# Altium project a0206-2006.PrjPcb (part 4 of 5)

## Sheet a0206-2006.13.SchDoc
size 558 x 431 mm
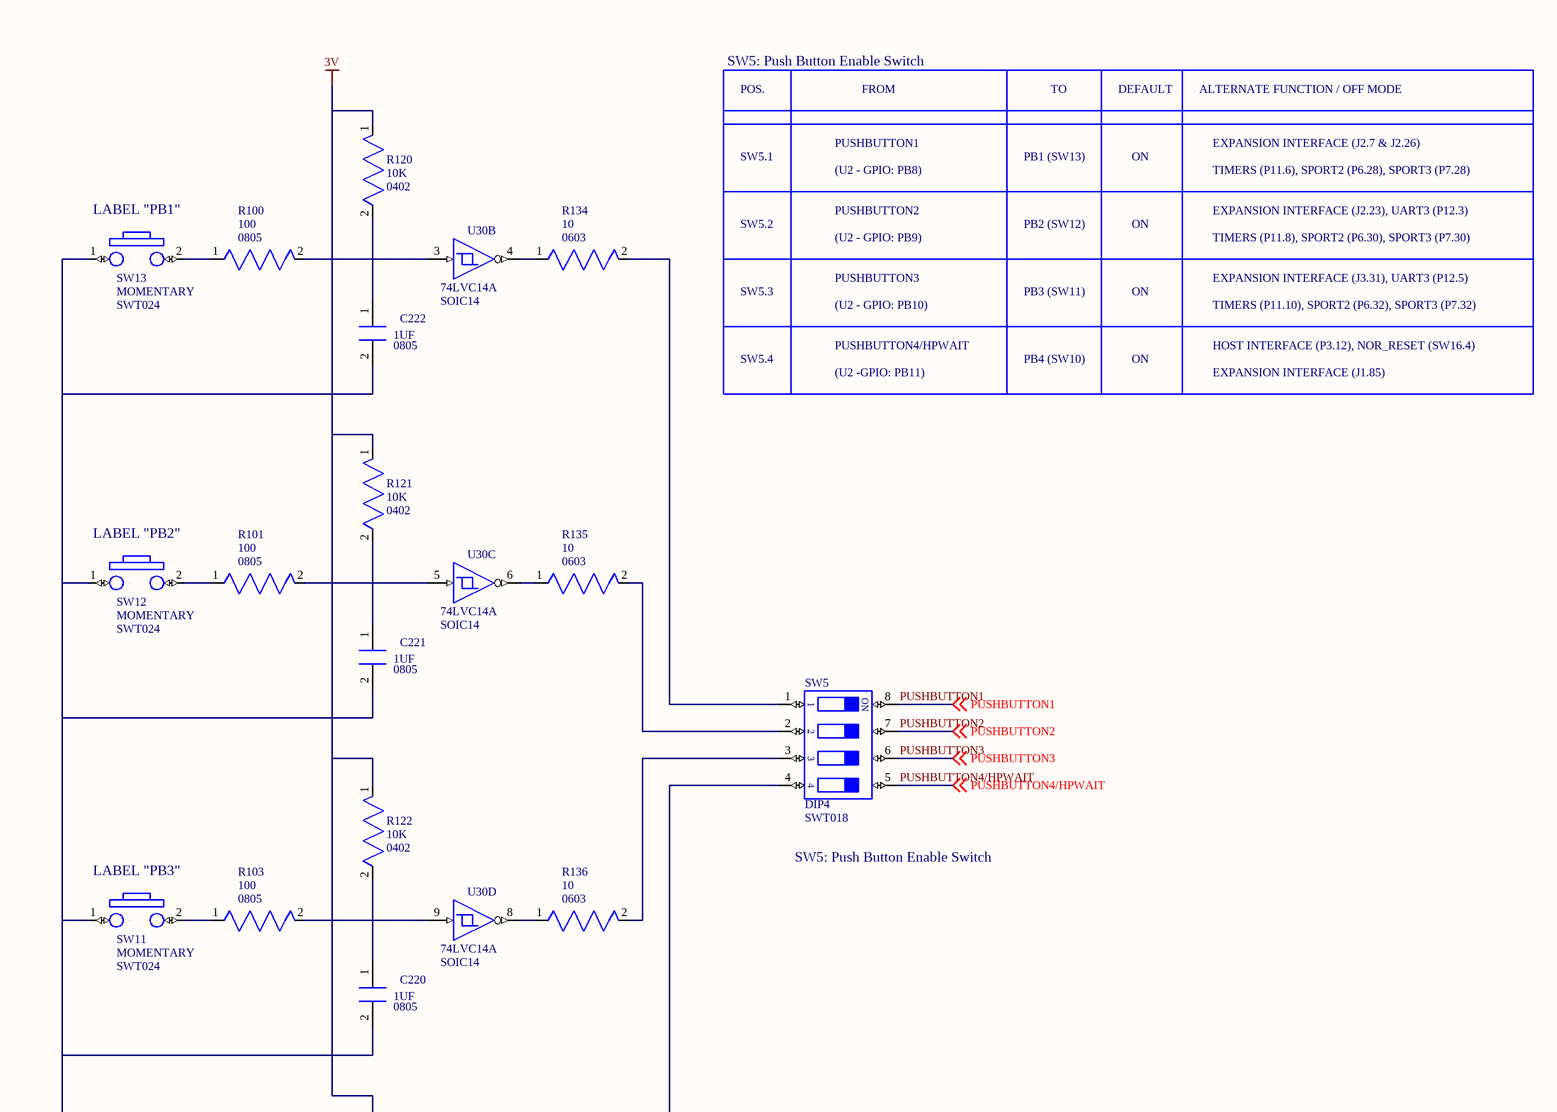
[diagram p41: a0206-2006.13.SchDoc, top left]
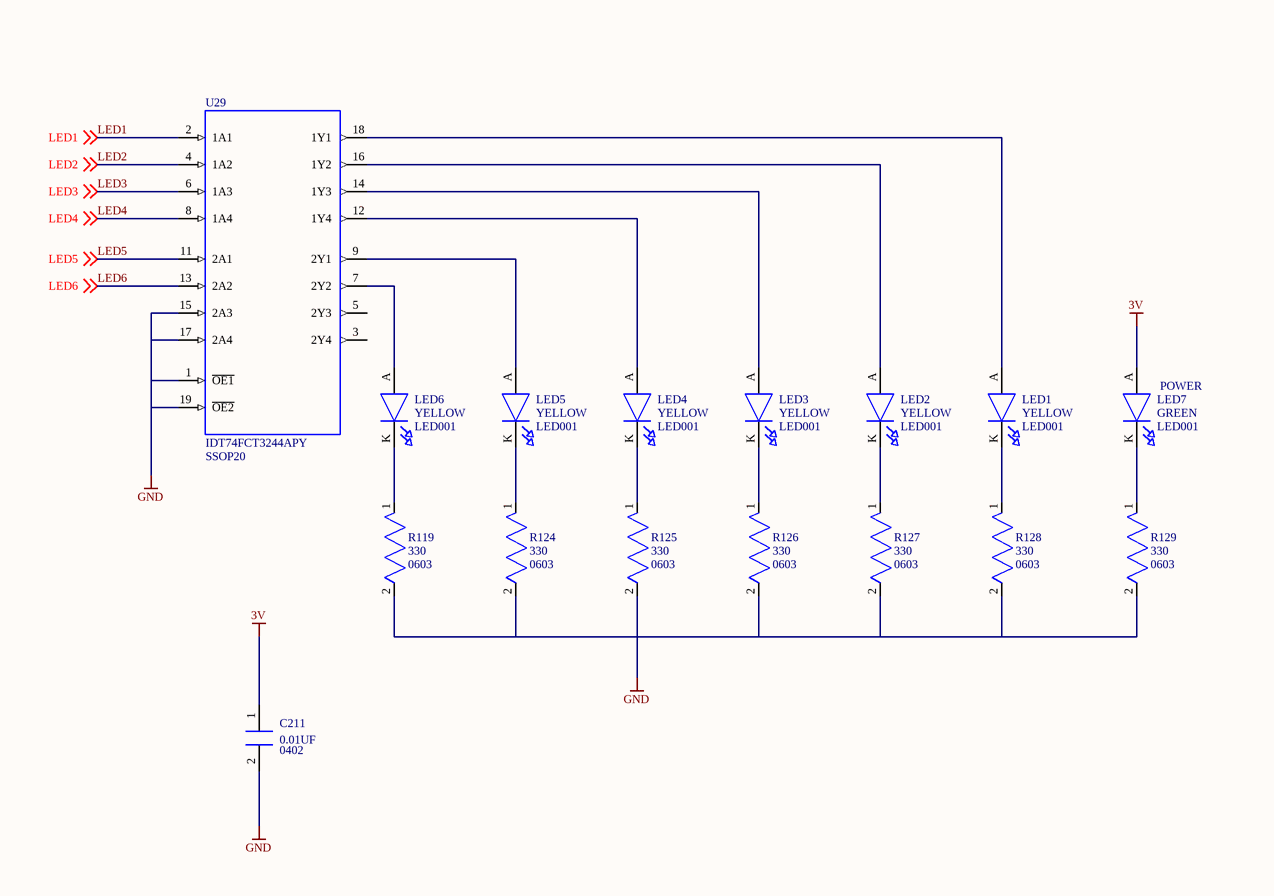
[diagram p42: a0206-2006.13.SchDoc, top right]
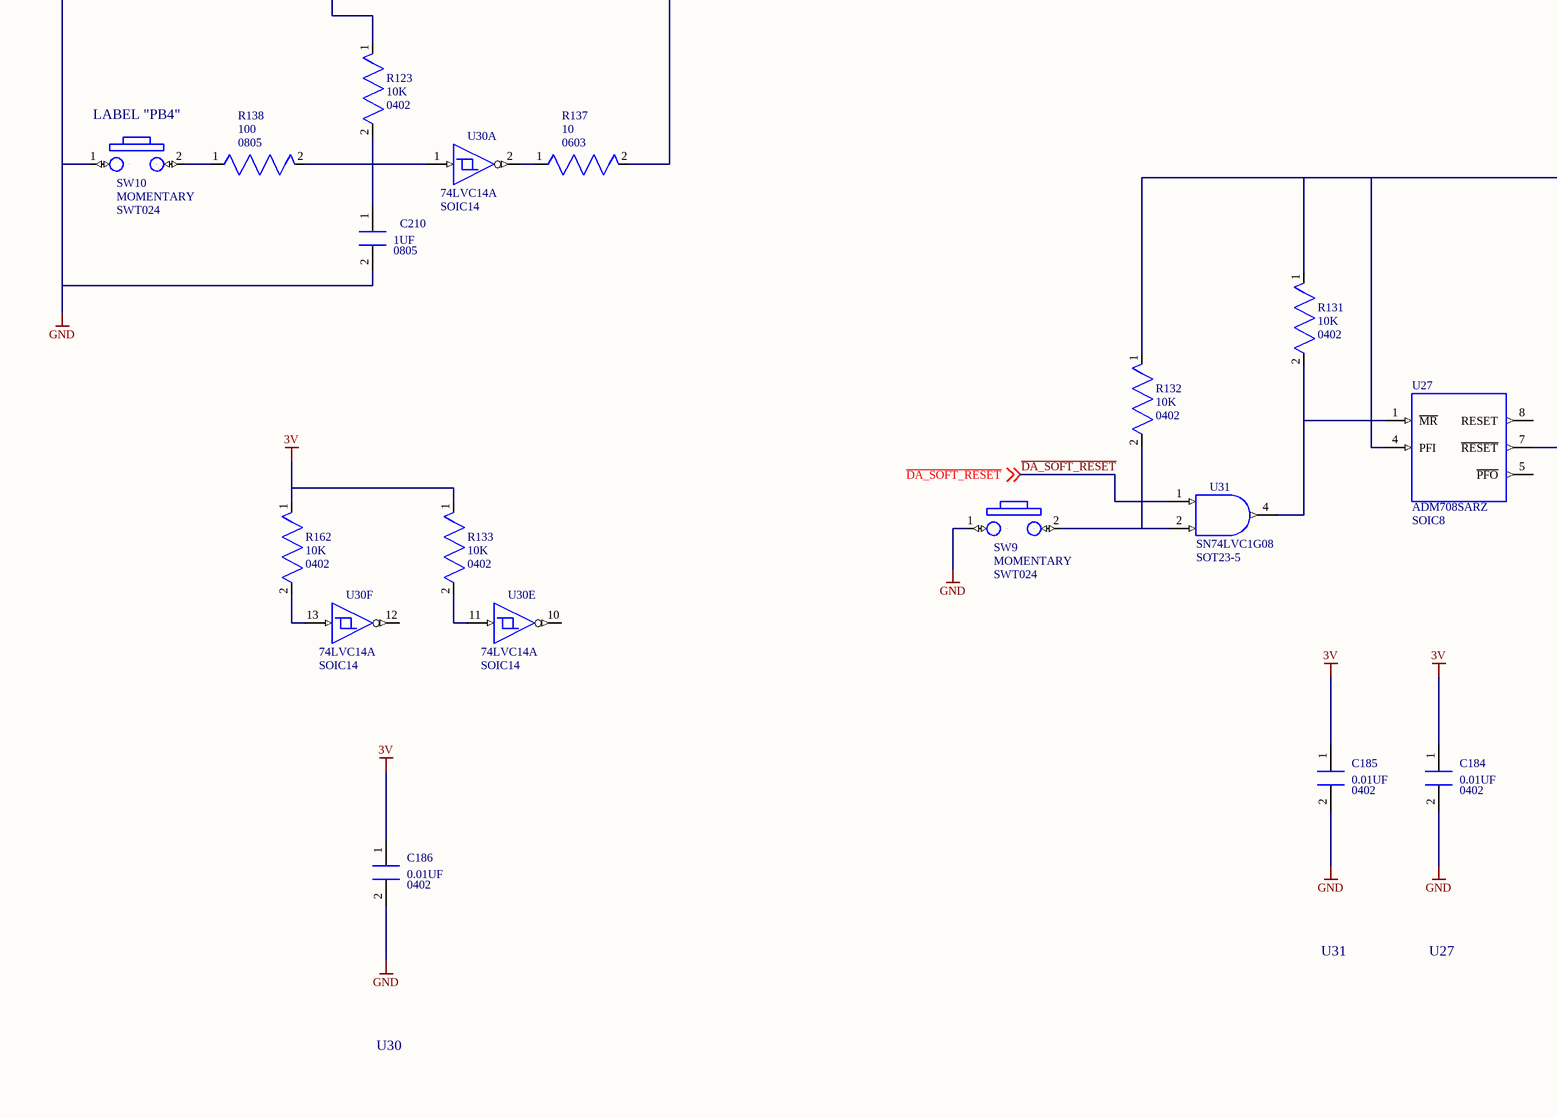
[diagram p43: a0206-2006.13.SchDoc, bottom left]
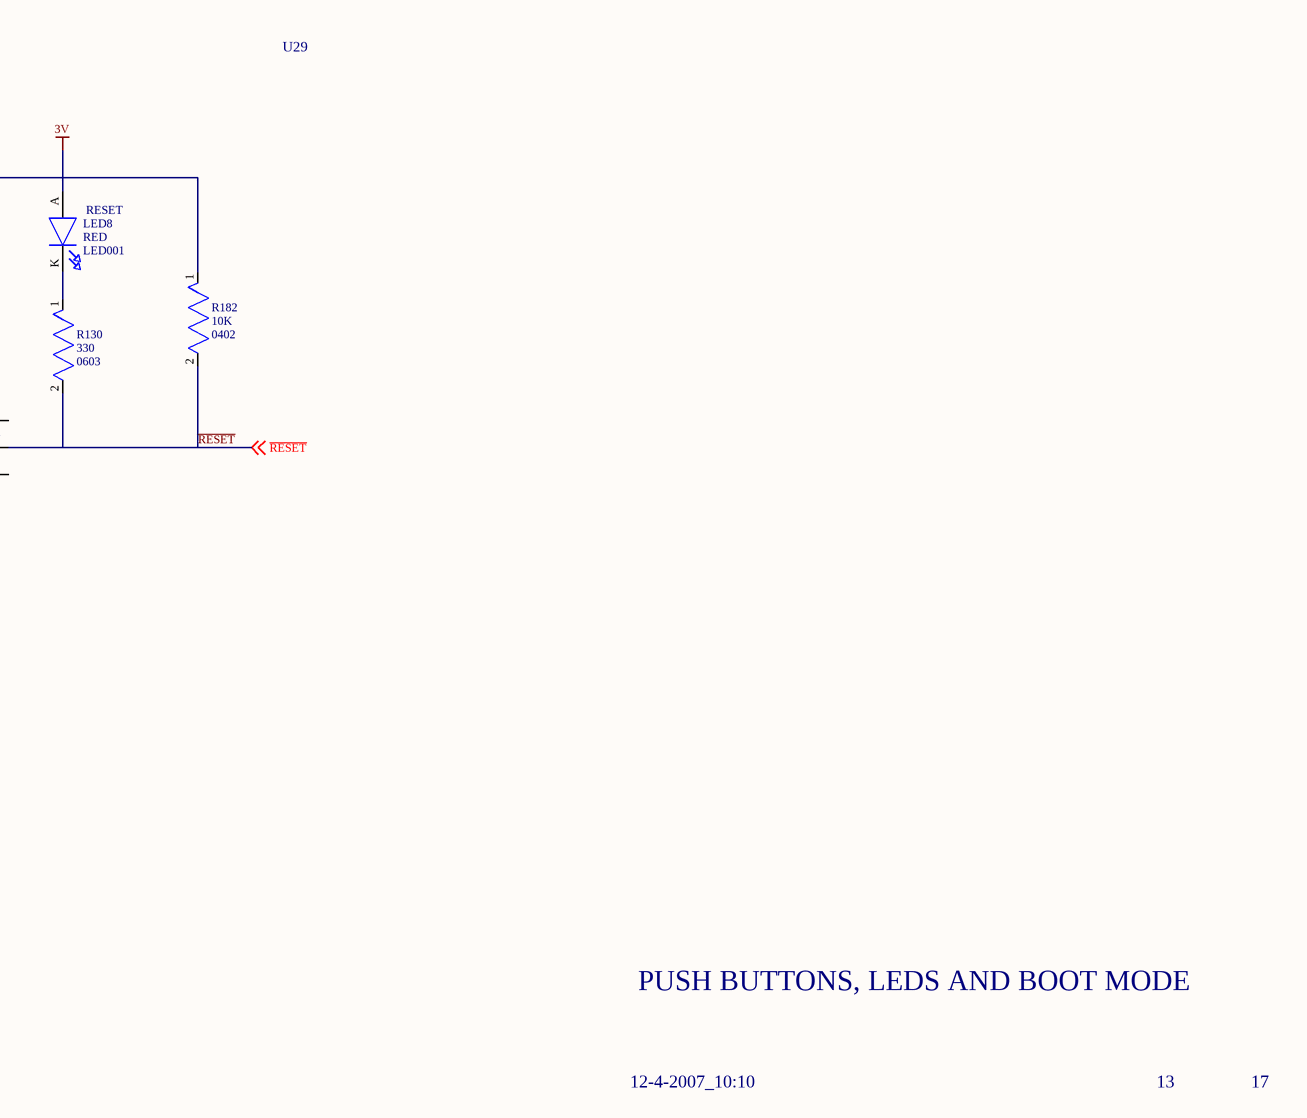
[diagram p44: a0206-2006.13.SchDoc, bottom right]

### Parts
C184  value 0.01UF  [0402]  (hidden comment: *)
C185  value 0.01UF  [0402]  (hidden comment: *)
C186  value 0.01UF  [0402]  (hidden comment: *)
C210  value 1UF  [0805]  (hidden comment: *)
C211  value 0.01UF  [0402]  (hidden comment: *)
C220  value 1UF  [0805]  (hidden comment: *)
C221  value 1UF  [0805]  (hidden comment: *)
C222  value 1UF  [0805]  (hidden comment: *)
LED1  value YELLOW  [LED001]  (hidden comment: *)
LED2  value YELLOW  [LED001]  (hidden comment: *)
LED3  value YELLOW  [LED001]  (hidden comment: *)
LED4  value YELLOW  [LED001]  (hidden comment: *)
LED5  value YELLOW  [LED001]  (hidden comment: *)
LED6  value YELLOW  [LED001]  (hidden comment: *)
LED7  value GREEN  [LED001]  (hidden comment: *)
LED8  value RED  [LED001]  (hidden comment: *)
R100  value 100  [0805]  (hidden comment: *)
R101  value 100  [0805]  (hidden comment: *)
R103  value 100  [0805]  (hidden comment: *)
R119  value 330  [0603]  (hidden comment: *)
R120  value 10K  [0402]  (hidden comment: *)
R121  value 10K  [0402]  (hidden comment: *)
R122  value 10K  [0402]  (hidden comment: *)
R123  value 10K  [0402]  (hidden comment: *)
R124  value 330  [0603]  (hidden comment: *)
R125  value 330  [0603]  (hidden comment: *)
R126  value 330  [0603]  (hidden comment: *)
R127  value 330  [0603]  (hidden comment: *)
R128  value 330  [0603]  (hidden comment: *)
R129  value 330  [0603]  (hidden comment: *)
R130  value 330  [0603]  (hidden comment: *)
R131  value 10K  [0402]  (hidden comment: *)
R132  value 10K  [0402]  (hidden comment: *)
R133  value 10K  [0402]  (hidden comment: *)
R134  value 10  [0603]  (hidden comment: *)
R135  value 10  [0603]  (hidden comment: *)
R136  value 10  [0603]  (hidden comment: *)
R137  value 10  [0603]  (hidden comment: *)
R138  value 100  [0805]  (hidden comment: *)
R162  value 10K  [0402]  (hidden comment: *)
R182  value 10K  [0402]  (hidden comment: *)
SW5  value DIP4  [SWT018]  (hidden comment: *)
SW9  value MOMENTARY  [SWT024]  (hidden comment: *)
SW10  value MOMENTARY  [SWT024]  (hidden comment: *)
SW11  value MOMENTARY  [SWT024]  (hidden comment: *)
SW12  value MOMENTARY  [SWT024]  (hidden comment: *)
SW13  value MOMENTARY  [SWT024]  (hidden comment: *)
U27  PART: ADM708SARZ  [SOIC8]  (hidden comment: *)
U29  PART: IDT74FCT3244APY  [SSOP20]  (hidden comment: *)
U30  PART: 74LVC14A  [SOIC14]  (hidden comment: *)  (parts A,B,C,D,E,F of 6)
U31  PART: SN74LVC1G08  [SOT23-5]  (hidden comment: *)

### Nets
3V: C184.1(A) C185.1(A) C186.1(A) C211.1(A) LED7.A(ANODE) LED8.A(ANODE) R120.1(N1) R121.1(N1) R122.1(N1) R123.1(N1) R131.1(N1) R132.1(N1) R133.1(N1) R162.1(N1) R182.1(N1) U27.4(PFI) U27.2(3V) U29.20(3V) U30.14(3V) U31.5(3V)
GND: C184.2(B) C185.2(B) C186.2(B) C210.2(B) C211.2(B) C220.2(B) C221.2(B) C222.2(B) R119.2(N2) R124.2(N2) R125.2(N2) R126.2(N2) R127.2(N2) R128.2(N2) R129.2(N2) SW9.1 SW10.1 SW11.1 SW12.1 SW13.1 U27.3(GND) U29.1(~{OE1}) U29.10(GND) U29.15(2A3) U29.17(2A4) U29.19(~{OE2}) U30.7(GND) U31.3(GND)
~{DA_SOFT_RESET}: U31.1(A) ; off-sheet ~{DA_SOFT_RESET}
LED1: U29.2(1A1) ; off-sheet LED1
LED2: U29.4(1A2) ; off-sheet LED2
LED3: U29.6(1A3) ; off-sheet LED3
LED4: U29.8(1A4) ; off-sheet LED4
LED5: U29.11(2A1) ; off-sheet LED5
LED6: U29.13(2A2) ; off-sheet LED6
PUSHBUTTON1: SW5.8 ; off-sheet PUSHBUTTON1
PUSHBUTTON2: SW5.7 ; off-sheet PUSHBUTTON2
PUSHBUTTON3: SW5.6 ; off-sheet PUSHBUTTON3
PUSHBUTTON4/HPWAIT: SW5.5 ; off-sheet PUSHBUTTON4/HPWAIT
~{RESET}: R130.2(N2) R182.2(N2) U27.7(~{RESET}) ; off-sheet ~{RESET}
NetC210_1: C210.1(A) R123.2(N2) R138.2(N2) U30.1(A)
NetC220_1: C220.1(A) R103.2(N2) R122.2(N2) U30.9(A)
NetC221_1: C221.1(A) R101.2(N2) R121.2(N2) U30.5(A)
NetC222_1: C222.1(A) R100.2(N2) R120.2(N2) U30.3(A)
NetLED1_A: LED1.A(ANODE) U29.18(1Y1)
NetLED1_K: LED1.K(CATHODE) R128.1(N1)
NetLED2_A: LED2.A(ANODE) U29.16(1Y2)
NetLED2_K: LED2.K(CATHODE) R127.1(N1)
NetLED3_A: LED3.A(ANODE) U29.14(1Y3)
NetLED3_K: LED3.K(CATHODE) R126.1(N1)
NetLED4_A: LED4.A(ANODE) U29.12(1Y4)
NetLED4_K: LED4.K(CATHODE) R125.1(N1)
NetLED5_A: LED5.A(ANODE) U29.9(2Y1)
NetLED5_K: LED5.K(CATHODE) R124.1(N1)
NetLED6_A: LED6.A(ANODE) U29.7(2Y2)
NetLED6_K: LED6.K(CATHODE) R119.1(N1)
NetLED7_K: LED7.K(CATHODE) R129.1(N1)
NetLED8_K: LED8.K(CATHODE) R130.1(N1)
NetR100_1: R100.1(N1) SW13.2
NetR101_1: R101.1(N1) SW12.2
NetR103_1: R103.1(N1) SW11.2
NetR131_2: R131.2(N2) U27.1(~{MR}) U31.4(Y)
NetR132_2: R132.2(N2) SW9.2 U31.2(B)
NetR133_2: R133.2(N2) U30.11(A)
NetR134_1: R134.1(N1) U30.4(Y)
NetR134_2: R134.2(N2) SW5.1
NetR135_1: R135.1(N1) U30.6(Y)
NetR135_2: R135.2(N2) SW5.2
NetR136_1: R136.1(N1) U30.8(Y)
NetR136_2: R136.2(N2) SW5.3
NetR137_1: R137.1(N1) U30.2(Y)
NetR137_2: R137.2(N2) SW5.4
NetR138_1: R138.1(N1) SW10.2
NetR162_2: R162.2(N2) U30.13(A)

Not connected (* = marked no-connect by the designer): U27 5(~{PFO}) 6 8(RESET); U29 3(2Y4) 5(2Y3); U30 10(Y) 12(Y)

### Notes on the sheet
- SW5: Push Button Enable Switch
- POS.
- FROM
- TO
- DEFAULT
- ALTERNATE FUNCTION / OFF MODE
- SW5.1
- PUSHBUTTON1
- PB1 (SW13)
- ON
- EXPANSION INTERFACE (J2.7 & J2.26)
- LABEL "PB1"
- SW5.2
- PUSHBUTTON2
- (U2 - GPIO: PB8)
- PB2 (SW12)
- TIMERS (P11.6), SPORT2 (P6.28), SPORT3 (P7.28)
- EXPANSION INTERFACE (J2.23), UART3 (P12.3)
- SW5.3
- PUSHBUTTON3
- (U2 - GPIO: PB9)
- PB3 (SW11)
- TIMERS (P11.8), SPORT2 (P6.30), SPORT3 (P7.30)
- EXPANSION INTERFACE (J3.31), UART3 (P12.5)
- SW5.4
- PUSHBUTTON4/HPWAIT
- (U2 - GPIO: PB10)
- PB4 (SW10)
- HOST INTERFACE (P3.12), NOR_RESET (SW16.4)
- TIMERS (P11.10), SPORT2 (P6.32), SPORT3 (P7.32)
- (U2 -GPIO: PB11)
- EXPANSION INTERFACE (J1.85)
- LABEL "PB2"
- (near LED7) POWER
- LABEL "PB3"
- U29
- LABEL "PB4"
- (near LED8) RESET
- U31
- U27
- PUSH BUTTONS, LEDS AND BOOT MODE
- U30
- 12-4-2007_10:10
- 13
- 17
- A
- B
- C
- D
- 1
- 2
- 3
- 20 Cotton Road
- 4
- DEVICES
- ANALOG
- Nashua, NH 03063
- PH: 1-800-ANALOGD
- Title
- ADSP-BF548 EZ-KIT LITE
- Size
- Board No.
- A0206-2006
- Rev
- 1.4B
- Date
- Sheet
- of
- (in symbol SW_DIP4.1) ON

### Library data of the parts
C184 C186 = CAP_NON_POLARIZED.2: PART_SPEC: CAPACITOR; LEVEL: STD; TYPE: X7R; BOARDS: BOTH; PRT_NUM: 7000279; VOLTAGE: 16V; TOLERANCE: 10%; PKG_TYPE: 0402; ROHS: ROHS
C185 = CAP_NON_POLARIZED.2: PART_SPEC: CAPACITOR; LEVEL: STD; TYPE: X7R; BOARDS: BOTH; TOLERANCE: 10%; VOLTAGE: 16V; PRT_NUM: 7000279; PKG_TYPE: 0402; ROHS: ROHS
C210 = CAP_NON_POLARIZED.2: PART_SPEC: CAPACITOR; LEVEL: STD; TYPE: X7R; BOARDS: BOTH; PRT_NUM: 7000264; VOLTAGE: 10V; TOLERANCE: 10%; PKG_TYPE: 0805; ROHS: ROHS
C211 = CAP_NON_POLARIZED.2: PART_SPEC: CAPACITOR; LEVEL: STD; TYPE: X7R; PRT_NUM: 7000279; VOLTAGE: 16V; TOLERANCE: 10%; BOARDS: BOTH; PKG_TYPE: 0402; ROHS: ROHS
C220 C222 = CAP_NON_POLARIZED.2: PART_SPEC: CAPACITOR; LEVEL: STD; TYPE: X7R; TOLERANCE: 10%; VOLTAGE: 10V; PRT_NUM: 7000264; BOARDS: BOTH; PKG_TYPE: 0805; ROHS: ROHS
C221 = CAP_NON_POLARIZED.2: PART_SPEC: CAPACITOR; LEVEL: STD; TYPE: X7R; PRT_NUM: 7000264; VOLTAGE: 10V; TOLERANCE: 10%; BOARDS: BOTH; PKG_TYPE: 0805; ROHS: ROHS
LED1-LED6 = LED_STANDARD.3: PART_SPEC: LED; LEVEL: STD; BOARDS: BOTH; PRT_NUM: 7000027; PKG_TYPE: LED001; ROHS: ROHS
LED7 = LED_STANDARD.3: PART_SPEC: LED; LEVEL: STD; BOARDS: BOTH; PRT_NUM: 7000499; PKG_TYPE: LED001; ROHS: ROHS
LED8 = LED_STANDARD.3: PART_SPEC: LED; LEVEL: STD; BOARDS: BOTH; PRT_NUM: 7000500; PKG_TYPE: LED001; ROHS: ROHS
R100 R103 = RES_STANDARD.1: PART_SPEC: RESISTOR; LEVEL: STD; POWER: 1/10W; BOARDS: BOTH; PRT_NUM: 7000097; TOLERANCE: 5%; PKG_TYPE: 0805; ROHS: ROHS
R101 = RES_STANDARD.1: PART_SPEC: RESISTOR; LEVEL: STD; POWER: 1/10W; BOARDS: BOTH; TOLERANCE: 5%; PRT_NUM: 7000097; PKG_TYPE: 0805; ROHS: ROHS
R119 R125 R127 R129 R130 = RES_STANDARD.2: PART_SPEC: RESISTOR; LEVEL: STD; POWER: 1/10W; BOARDS: BOTH; PRT_NUM: 7000368; TOLERANCE: 5%; PKG_TYPE: 0603; ROHS: ROHS
R120-R123 R162 = RES_STANDARD.2: PART_SPEC: RESISTOR; LEVEL: STD; POWER: 1/16W; BOARDS: BOTH; TOLERANCE: 5%; PRT_NUM: 7000280; PKG_TYPE: 0402; ROHS: ROHS
R124 R126 R128 = RES_STANDARD.2: PART_SPEC: RESISTOR; LEVEL: STD; POWER: 1/10W; BOARDS: BOTH; TOLERANCE: 5%; PRT_NUM: 7000368; PKG_TYPE: 0603; ROHS: ROHS
R131 R132 R182 = RES_STANDARD.2: PART_SPEC: RESISTOR; LEVEL: STD; POWER: 1/16W; BOARDS: BOTH; PRT_NUM: 7000280; TOLERANCE: 5%; PKG_TYPE: 0402; ROHS: ROHS
R133 = RES_STANDARD.2: PART_SPEC: RESISTOR; LEVEL: STD; POWER: 1/16W; PRT_NUM: 7000280; TOLERANCE: 5%; BOARDS: BOTH; PKG_TYPE: 0402; ROHS: ROHS
R134 R136 = RES_STANDARD.1: PART_SPEC: RESISTOR; LEVEL: STD; POWER: 1/10W; BOARDS: BOTH; TOLERANCE: 5%; PRT_NUM: 7000374; PKG_TYPE: 0603; ROHS: ROHS
R135 R137 = RES_STANDARD.1: PART_SPEC: RESISTOR; LEVEL: STD; POWER: 1/10W; BOARDS: BOTH; PRT_NUM: 7000374; TOLERANCE: 5%; PKG_TYPE: 0603; ROHS: ROHS
R138 = RES_STANDARD.1: PART_SPEC: RESISTOR; LEVEL: STD; TOLERANCE: 5%; PRT_NUM: 7000097; BOARDS: BOTH; POWER: 1/10W; PKG_TYPE: 0805; ROHS: ROHS
SW5 = SW_DIP4.1: 4PIN-SMT-SWT; PART_SPEC: SWITCH; LEVEL: STD; PRT_NUM: 6000144; BOARDS: KIT; PKG_TYPE: SWT018; ROHS: ROHS
SW9-SW13 = SW_MOM_PB.1: 6MM; PART_SPEC: SWITCH; LEVEL: STD; BOARDS: BOTH; PRT_NUM: 6000832; PKG_TYPE: SWT024; ROHS: ROHS
U27 = ICS_ADM708AR.1: VOLTAGE-SUPERVISOR; NC: 6; LEVEL: STD; BOARDS: BOTH; PRT_NUM: 30-024902-01; PKG_TYPE: SOIC8; ROHS: ROHS; WEB: http://www.analog.com/en/prod/0%2C2877%2CADM708%2C00.html
U29 = ICS_SN74XXX244.1: 3.3V-OCTAL-BUFFER; LEVEL: STD; BOARDS: BOTH; PRT_NUM: 1000106; PKG_TYPE: SSOP20; ROHS: ROHS; WEB: http://www.idt.com/?genID
U30 = ICS_SN74XXX14.1: HEX-INVER-SCHMITT-TRIGGER; LEVEL: STD; BOARDS: BOTH; PRT_NUM: 1000097; PKG_TYPE: SOIC14; WEB: http://focus.ti.com/docs/prod/folders/print/sn74lvc14a.html; ROHS: ROHS
U31 = ICS_SN74XXX1G08.1: SINGLE 2-INPUT AND; LEVEL: STD; BOARDS: BOTH; PRT_NUM: 1000287; PKG_TYPE: SOT23-5; ROHS: ROHS; WEB: http://focus.ti.com/docs/prod/folders/print/sn74lvc1g08.html

## Sheet a0206-2006.14.SchDoc
size 558 x 431 mm
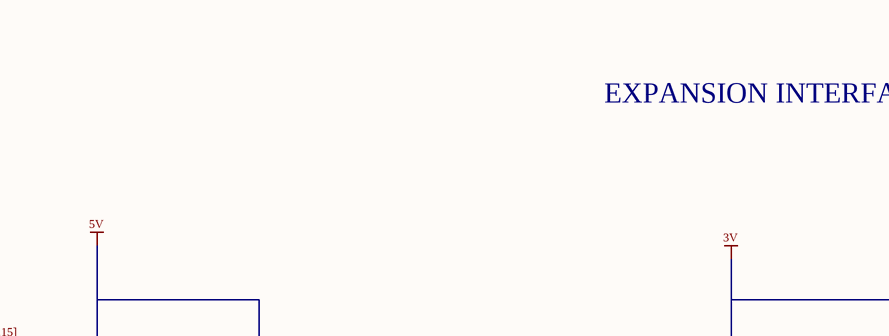
[diagram p45: a0206-2006.14.SchDoc, top left]
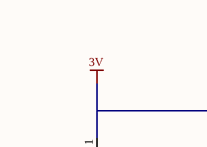
[diagram p46: a0206-2006.14.SchDoc, top right]
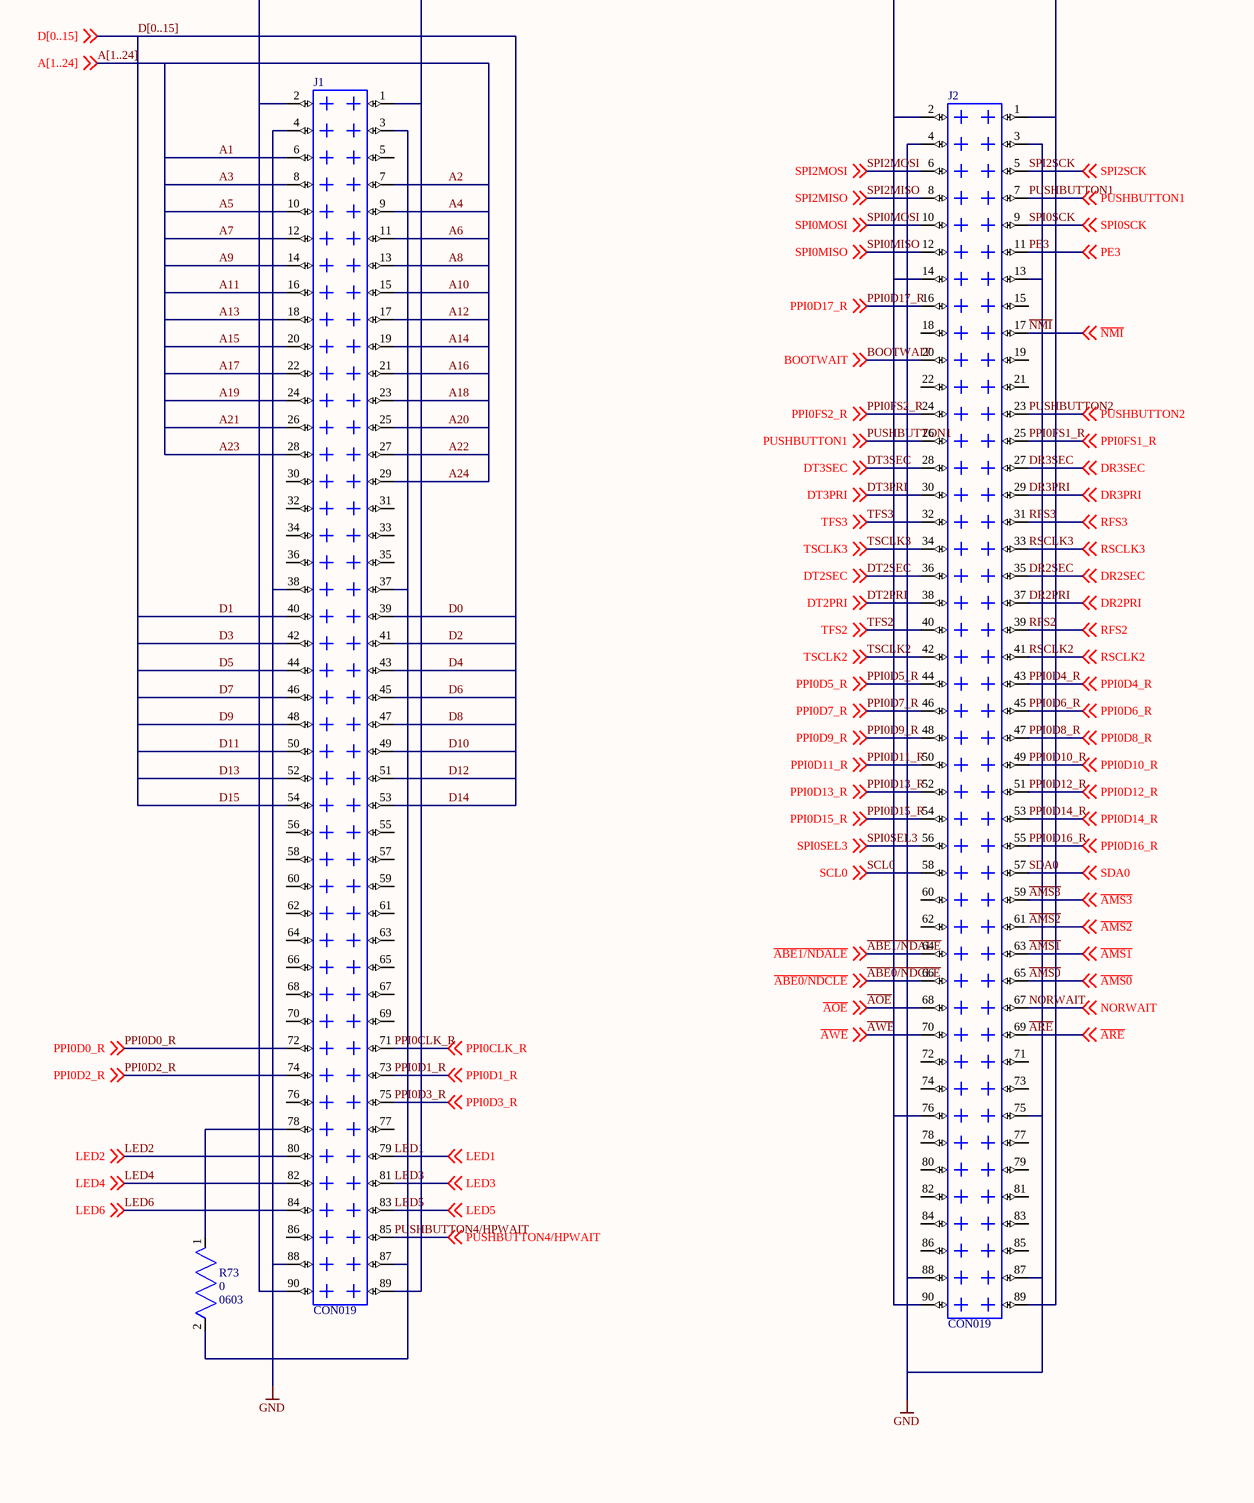
[diagram p47: a0206-2006.14.SchDoc, bottom left]
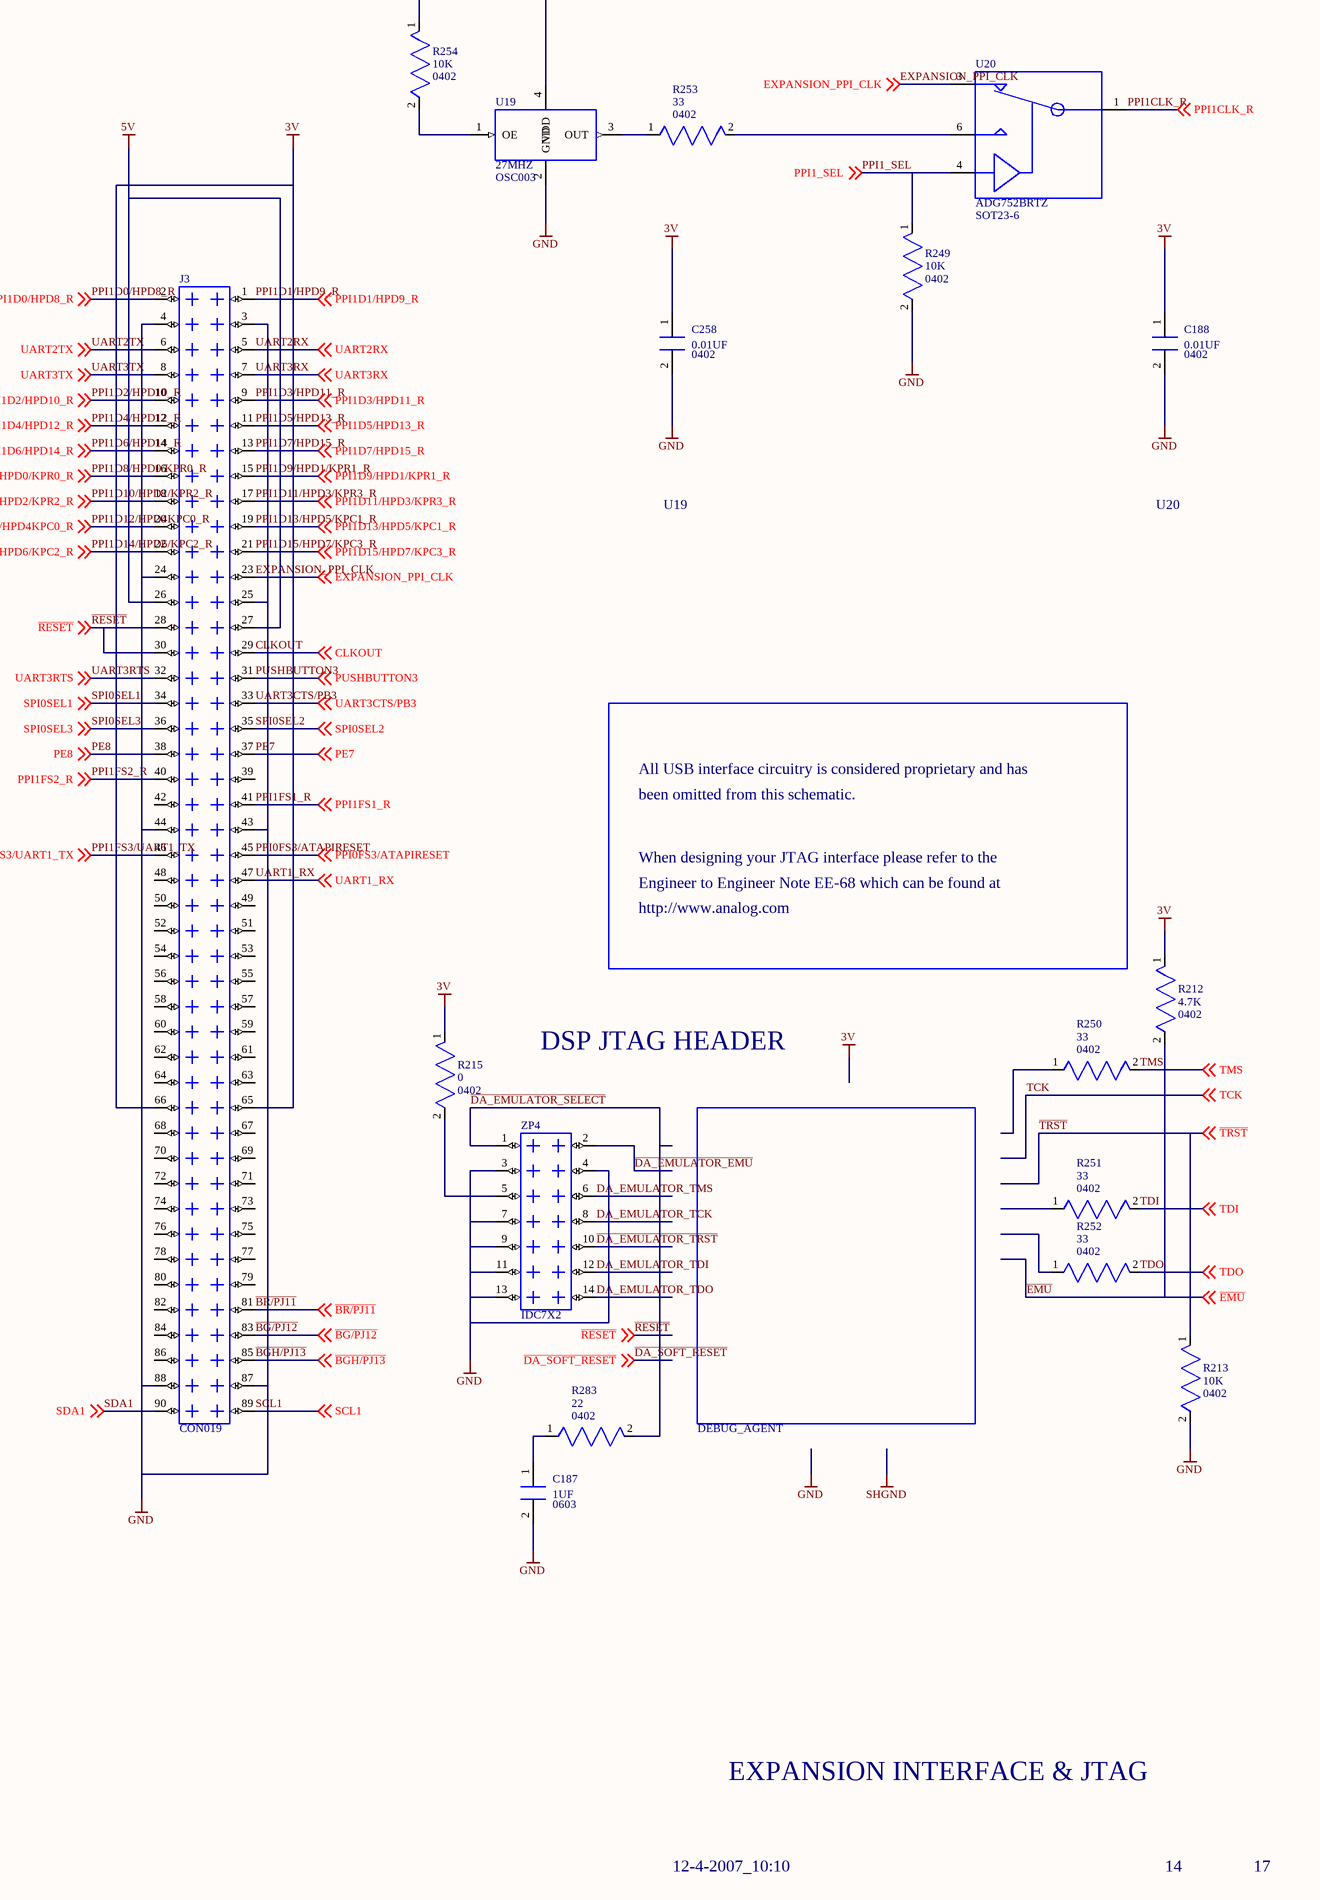
[diagram p48: a0206-2006.14.SchDoc, bottom right]

### Parts
(Parts that share a designator on the sheet are numbered #1, #2 ... from top to bottom, then left to right.)
*#2  DEBUG_AGENT  [DEBUG_AGENT]
C187  value 1UF  [0603]  (hidden comment: *)
C188  value 0.01UF  [0402]  (hidden comment: *)
C258  value 0.01UF  [0402]  (hidden comment: *)
J1  *  [CON019]  (value not drawn)
J2  *  [CON019]  (value not drawn)
J3  *  [CON019]  (value not drawn)
R73  value 0  [0603]  (hidden comment: *)
R212  value 4.7K  [0402]  (hidden comment: *)
R213  value 10K  [0402]  (hidden comment: *)
R215  value 0  [0402]  (hidden comment: *)
R249  value 10K  [0402]  (hidden comment: *)
R250  value 33  [0402]  (hidden comment: *)
R251  value 33  [0402]  (hidden comment: *)
R252  value 33  [0402]  (hidden comment: *)
R253  value 33  [0402]  (hidden comment: *)
R254  value 10K  [0402]  (hidden comment: *)
R283  value 22  [0402]  (hidden comment: *)
U19  value 27MHZ  [OSC003]  (hidden comment: *)
U20  PART: ADG752BRTZ  [SOT23-6]  (hidden comment: *)
ZP4  *  [IDC7X2]  (value not drawn)

### Nets
3V: C188.1(A) C258.1(A) J2.1 J2.2 J2.14 J2.76 J2.89 J2.90 J3.65 J3.66 R212.1(N1) R215.1(N1) R254.1(N1) U19.4(VDD) U20.2(3V)
5V: J1.1 J1.2 J1.89 J1.90 J3.26 J3.27
GND: C187.2(B) C188.2(B) C258.2(B) J1.3 J1.4 J1.37 J1.38 J1.87 J1.88 J2.3 J2.4 J2.13 J2.75 J2.87 J2.88 J3.3 J3.4 J3.24 J3.25 J3.43 J3.44 J3.87 J3.88 R73.2(N2) R213.2(N2) R249.2(N2) U19.2(GND) U20.5(GND) ZP4.3 ZP4.4 ZP4.7 ZP4.9 ZP4.11 ZP4.13
A1: J1.6
A2: J1.7
A3: J1.8
A4: J1.9
A5: J1.10
A6: J1.11
A7: J1.12
A8: J1.13
A9: J1.14
A10: J1.15
A11: J1.16
A12: J1.17
A13: J1.18
A14: J1.19
A15: J1.20
A16: J1.21
A17: J1.22
A18: J1.23
A19: J1.24
A20: J1.25
A21: J1.26
A22: J1.27
A23: J1.28
A24: J1.29
~{ABE0/NDCLE}: J2.66 ; off-sheet ~{ABE0/NDCLE}
~{ABE1/NDALE}: J2.64 ; off-sheet ~{ABE1/NDALE}
~{AMS0}: J2.65 ; off-sheet ~{AMS0}
~{AMS1}: J2.63 ; off-sheet ~{AMS1}
~{AMS2}: J2.61 ; off-sheet ~{AMS2}
~{AMS3}: J2.59 ; off-sheet ~{AMS3}
~{AOE}: J2.68 ; off-sheet ~{AOE}
~{ARE}: J2.69 ; off-sheet ~{ARE}
~{AWE}: J2.70 ; off-sheet ~{AWE}
~{BG/PJ12}: J3.83 ; off-sheet ~{BG/PJ12}
~{BGH/PJ13}: J3.85 ; off-sheet ~{BGH/PJ13}
~{BR/PJ11}: J3.81 ; off-sheet ~{BR/PJ11}
BOOTWAIT: J2.20 ; off-sheet BOOTWAIT
CLKOUT: J3.29 ; off-sheet CLKOUT
D0: J1.39
D1: J1.40
D2: J1.41
D3: J1.42
D4: J1.43
D5: J1.44
D6: J1.45
D7: J1.46
D8: J1.47
D9: J1.48
D10: J1.49
D11: J1.50
D12: J1.51
D13: J1.52
D14: J1.53
D15: J1.54
~{DA_EMULATOR_EMU}: ZP4.2
~{DA_EMULATOR_SELECT}: R283.2(N2) ZP4.1
~{DA_EMULATOR_TRST}: ZP4.10
DA_EMULATOR_TCK: ZP4.8
DA_EMULATOR_TDI: ZP4.12
DA_EMULATOR_TDO: ZP4.14
DA_EMULATOR_TMS: ZP4.6
DR2PRI: J2.37 ; off-sheet DR2PRI
DR2SEC: J2.35 ; off-sheet DR2SEC
DR3PRI: J2.29 ; off-sheet DR3PRI
DR3SEC: J2.27 ; off-sheet DR3SEC
DT2PRI: J2.38 ; off-sheet DT2PRI
DT2SEC: J2.36 ; off-sheet DT2SEC
DT3PRI: J2.30 ; off-sheet DT3PRI
DT3SEC: J2.28 ; off-sheet DT3SEC
~{EMU}: R212.2(N2) ; off-sheet ~{EMU}
EXPANSION_PPI_CLK: J3.23 U20.3(S1) ; off-sheet EXPANSION_PPI_CLK
LED1: J1.79 ; off-sheet LED1
LED2: J1.80 ; off-sheet LED2
LED3: J1.81 ; off-sheet LED3
LED4: J1.82 ; off-sheet LED4
LED5: J1.83 ; off-sheet LED5
LED6: J1.84 ; off-sheet LED6
~{NMI}: J2.17 ; off-sheet ~{NMI}
NORWAIT: J2.67 ; off-sheet NORWAIT
PE3: J2.11 ; off-sheet PE3
PE7: J3.37 ; off-sheet PE7
PE8: J3.38 ; off-sheet PE8
PPI0CLK_R: J1.71 ; off-sheet PPI0CLK_R
PPI0D0_R: J1.72 ; off-sheet PPI0D0_R
PPI0D1_R: J1.73 ; off-sheet PPI0D1_R
PPI0D2_R: J1.74 ; off-sheet PPI0D2_R
PPI0D3_R: J1.75 ; off-sheet PPI0D3_R
PPI0D4_R: J2.43 ; off-sheet PPI0D4_R
PPI0D5_R: J2.44 ; off-sheet PPI0D5_R
PPI0D6_R: J2.45 ; off-sheet PPI0D6_R
PPI0D7_R: J2.46 ; off-sheet PPI0D7_R
PPI0D8_R: J2.47 ; off-sheet PPI0D8_R
PPI0D9_R: J2.48 ; off-sheet PPI0D9_R
PPI0D10_R: J2.49 ; off-sheet PPI0D10_R
PPI0D11_R: J2.50 ; off-sheet PPI0D11_R
PPI0D12_R: J2.51 ; off-sheet PPI0D12_R
PPI0D13_R: J2.52 ; off-sheet PPI0D13_R
PPI0D14_R: J2.53 ; off-sheet PPI0D14_R
PPI0D15_R: J2.54 ; off-sheet PPI0D15_R
PPI0D16_R: J2.55 ; off-sheet PPI0D16_R
PPI0D17_R: J2.16 ; off-sheet PPI0D17_R
PPI0FS1_R: J2.25 ; off-sheet PPI0FS1_R
PPI0FS2_R: J2.24 ; off-sheet PPI0FS2_R
PPI0FS3/ATAPIRESET: J3.45 ; off-sheet PPI0FS3/ATAPIRESET
PPI1_SEL: R249.1(N1) U20.4(IN) ; off-sheet PPI1_SEL
PPI1CLK_R: U20.1(D) ; off-sheet PPI1CLK_R
PPI1D0/HPD8_R: J3.2 ; off-sheet PPI1D0/HPD8_R
PPI1D1/HPD9_R: J3.1 ; off-sheet PPI1D1/HPD9_R
PPI1D2/HPD10_R: J3.10 ; off-sheet PPI1D2/HPD10_R
PPI1D3/HPD11_R: J3.9 ; off-sheet PPI1D3/HPD11_R
PPI1D4/HPD12_R: J3.12 ; off-sheet PPI1D4/HPD12_R
PPI1D5/HPD13_R: J3.11 ; off-sheet PPI1D5/HPD13_R
PPI1D6/HPD14_R: J3.14 ; off-sheet PPI1D6/HPD14_R
PPI1D7/HPD15_R: J3.13 ; off-sheet PPI1D7/HPD15_R
PPI1D8/HPD0/KPR0_R: J3.16 ; off-sheet PPI1D8/HPD0/KPR0_R
PPI1D9/HPD1/KPR1_R: J3.15 ; off-sheet PPI1D9/HPD1/KPR1_R
PPI1D10/HPD2/KPR2_R: J3.18 ; off-sheet PPI1D10/HPD2/KPR2_R
PPI1D11/HPD3/KPR3_R: J3.17 ; off-sheet PPI1D11/HPD3/KPR3_R
PPI1D12/HPD4KPC0_R: J3.20 ; off-sheet PPI1D12/HPD4KPC0_R
PPI1D13/HPD5/KPC1_R: J3.19 ; off-sheet PPI1D13/HPD5/KPC1_R
PPI1D14/HPD6/KPC2_R: J3.22 ; off-sheet PPI1D14/HPD6/KPC2_R
PPI1D15/HPD7/KPC3_R: J3.21 ; off-sheet PPI1D15/HPD7/KPC3_R
PPI1FS1_R: J3.41 ; off-sheet PPI1FS1_R
PPI1FS2_R: J3.40 ; off-sheet PPI1FS2_R
PPI1FS3/UART1_TX: J3.46 ; off-sheet PPI1FS3/UART1_TX
PUSHBUTTON1: J2.7 J2.26 ; off-sheet PUSHBUTTON1
PUSHBUTTON2: J2.23 ; off-sheet PUSHBUTTON2
PUSHBUTTON3: J3.31 ; off-sheet PUSHBUTTON3
PUSHBUTTON4/HPWAIT: J1.85 ; off-sheet PUSHBUTTON4/HPWAIT
~{RESET}: J3.28 J3.30 ; off-sheet ~{RESET}
RFS2: J2.39 ; off-sheet RFS2
RFS3: J2.31 ; off-sheet RFS3
RSCLK2: J2.41 ; off-sheet RSCLK2
RSCLK3: J2.33 ; off-sheet RSCLK3
SCL0: J2.58 ; off-sheet SCL0
SCL1: J3.89 ; off-sheet SCL1
SDA0: J2.57 ; off-sheet SDA0
SDA1: J3.90 ; off-sheet SDA1
SPI0MISO: J2.12 ; off-sheet SPI0MISO
SPI0MOSI: J2.10 ; off-sheet SPI0MOSI
SPI0SCK: J2.9 ; off-sheet SPI0SCK
SPI0SEL1: J3.34 ; off-sheet SPI0SEL1
SPI0SEL2: J3.35 ; off-sheet SPI0SEL2
SPI0SEL3: J2.56 J3.36 ; off-sheet SPI0SEL3
SPI2MISO: J2.8 ; off-sheet SPI2MISO
SPI2MOSI: J2.6 ; off-sheet SPI2MOSI
SPI2SCK: J2.5 ; off-sheet SPI2SCK
~{TRST}: R213.1(N1) ; off-sheet ~{TRST}
TDI: R251.2(N2) ; off-sheet TDI
TDO: R252.2(N2) ; off-sheet TDO
TFS2: J2.40 ; off-sheet TFS2
TFS3: J2.32 ; off-sheet TFS3
TMS: R250.2(N2) ; off-sheet TMS
TSCLK2: J2.42 ; off-sheet TSCLK2
TSCLK3: J2.34 ; off-sheet TSCLK3
UART1_RX: J3.47 ; off-sheet UART1_RX
UART2RX: J3.5 ; off-sheet UART2RX
UART2TX: J3.6 ; off-sheet UART2TX
UART3CTS/PB3: J3.33 ; off-sheet UART3CTS/PB3
UART3RTS: J3.32 ; off-sheet UART3RTS
UART3RX: J3.7 ; off-sheet UART3RX
UART3TX: J3.8 ; off-sheet UART3TX
NetC187_1: C187.1(A) R283.1(N1)
NetJ1_78: J1.78 R73.1(N1)
NetR215_2: R215.2(N2) ZP4.5
NetR253_1: R253.1(N1) U19.3(OUT)
NetR253_2: R253.2(N2) U20.6(S2)
NetR254_2: R254.2(N2) U19.1(OE)

Not connected (* = marked no-connect by the designer): J1 5 30 31 32 33 34 35 36 55 56 57 58 59 60 61 62 63 64 65 66 67 68 69 70 76 77 86; J2 15 18 19 21 22 60 62 71 72 73 74 77 78 79 80 81 82 83 84 85 86; J3 39 42 48 49 50 51 52 53 54 55 56 57 58 59 60 61 62 63 64 67 68 69 70 71 72 73 74 75 76 77 78 79 80 82 84 86; R250 1(N1); R251 1(N1); R252 1(N1)

### Buses and harness runs
bus A[1..24]
bus D[0..15]

### Notes on the sheet
- EXPANSION INTERFACE (TYPE B)
- U19
- U20
- All USB interface circuitry is considered proprietary and has
- been omitted from this schematic.
- When designing your JTAG interface please refer to the
- Engineer to Engineer Note EE-68 which can be found at
- http://www.analog.com
- DSP JTAG HEADER
- EXPANSION INTERFACE & JTAG
- 12-4-2007_10:10
- 14
- 17
- A
- B
- C
- D
- 1
- 2
- 3
- 20 Cotton Road
- 4
- DEVICES
- ANALOG
- Nashua, NH 03063
- PH: 1-800-ANALOGD
- Title
- ADSP-BF548 EZ-KIT LITE
- Size
- Board No.
- A0206-2006
- Rev
- 1.4B
- Date
- Sheet
- of

### Library data of the parts
*#2 = DEBUG_AGENT.1: CLASS: DA; PART: DEBUG_AGENT; PKG_TYPE: DEBUG_AGENT; LEVEL: DA; DEVICE: DEBUG_AGENT
C187 = CAP_NON_POLARIZED.2: PART_SPEC: CAPACITOR; LEVEL: STD; TOLERANCE: 10%; VOLTAGE: 16V; PRT_NUM: 7000344; BOARDS: BOTH; TYPE: X5R; PKG_TYPE: 0603; ROHS: ROHS
C188 = CAP_NON_POLARIZED.2: PART_SPEC: CAPACITOR; LEVEL: STD; TOLERANCE: 10%; VOLTAGE: 16V; PRT_NUM: 7000279; BOARDS: BOTH; TYPE: X7R; PKG_TYPE: 0402; ROHS: ROHS
C258 = CAP_NON_POLARIZED.2: as C184 on sheet a0206-2006.13; PKG_TYPE: 0402; ROHS: ROHS
J1-J3 = CON_45X2_F.1: SOCKET SMT; PART_SPEC: CONNECTOR; LEVEL: STD; PRT_NUM: 6000125; BOARDS: KIT; CONFIGURATION: 45X2; PKG_TYPE: CON019; TYPE: .05; ROHS: ROHS
R73 = RES_STANDARD.2: PART_SPEC: RESISTOR; LEVEL: STD; POWER: 1/10W; TOLERANCE: 5%; PRT_NUM: 7000371; BOARDS: BOTH; PKG_TYPE: 0603; ROHS: ROHS
R212 = RES_STANDARD.2: PART_SPEC: RESISTOR; LEVEL: STD; PRT_NUM: 7000281; TOLERANCE: 5%; BOARDS: BOTH; POWER: 1/16W; PKG_TYPE: 0402; ROHS: ROHS
R213 R249 = RES_STANDARD.2: as R120 on sheet a0206-2006.13; PKG_TYPE: 0402; ROHS: ROHS
R215 = RES_STANDARD.2: PART_SPEC: RESISTOR; LEVEL: STD; POWER: 1/16W; BOARDS: BOTH; TOLERANCE: 5%; PRT_NUM: 7000282; PKG_TYPE: 0402; ROHS: ROHS
R250 R252 = RES_STANDARD.1: PART_SPEC: RESISTOR; LEVEL: STD; PRT_NUM: 7000285; POWER: 1/16W; TOLERANCE: 5%; PKG_TYPE: 0402; ROHS: ROHS
R251 = RES_STANDARD.1: PART_SPEC: RESISTOR; LEVEL: STD; TOLERANCE: 5%; POWER: 1/16W; PRT_NUM: 7000285; PKG_TYPE: 0402; ROHS: ROHS
R253 = RES_STANDARD.1: PART_SPEC: RESISTOR; LEVEL: STD; PRT_NUM: 7000285; TOLERANCE: 5%; BOARDS: BOTH; POWER: 1/16W; PKG_TYPE: 0402; ROHS: ROHS
R254 = RES_STANDARD.2: PART_SPEC: RESISTOR; LEVEL: STD; PRT_NUM: 7000280; TOLERANCE: 5%; BOARDS: BOTH; POWER: 1/16W; PKG_TYPE: 0402; ROHS: ROHS
R283 = RES_STANDARD.1: PART_SPEC: RESISTOR; LEVEL: STD; TOLERANCE: 5%; POWER: 1/16W; PRT_NUM: 7000284; PKG_TYPE: 0402; ROHS: ROHS
U19 = OSC_SMT_OE_POWER.1: OSCILLATOR; LEVEL: STD; PRT_NUM: 1000407; BOARDS: BOTH; PART_SPEC: OSCILLATOR; PKG_TYPE: OSC003; ROHS: ROHS
U20 = ICS_AD752.1: CMOS SPDT SWITCH; LEVEL: STD; PRT_NUM: 30-025203-01; PKG_TYPE: SOT23-6; WEB: http://www.analog.com/en/prod/0%2C2877%2CADG752%2C00.html; ROHS: ROHS
ZP4 = CON_7X2.1: HEADER; PART_SPEC: CONNECTOR; LEVEL: STD; CLASS: DA; PRT_NUM: 6000777; BOARDS: BOTH; CONFIGURATION: 7X2; PKG_TYPE: IDC7X2; TYPE: IDC; ROHS: ROHS

## Sheet a0206-2006.15.SchDoc
size 558 x 431 mm
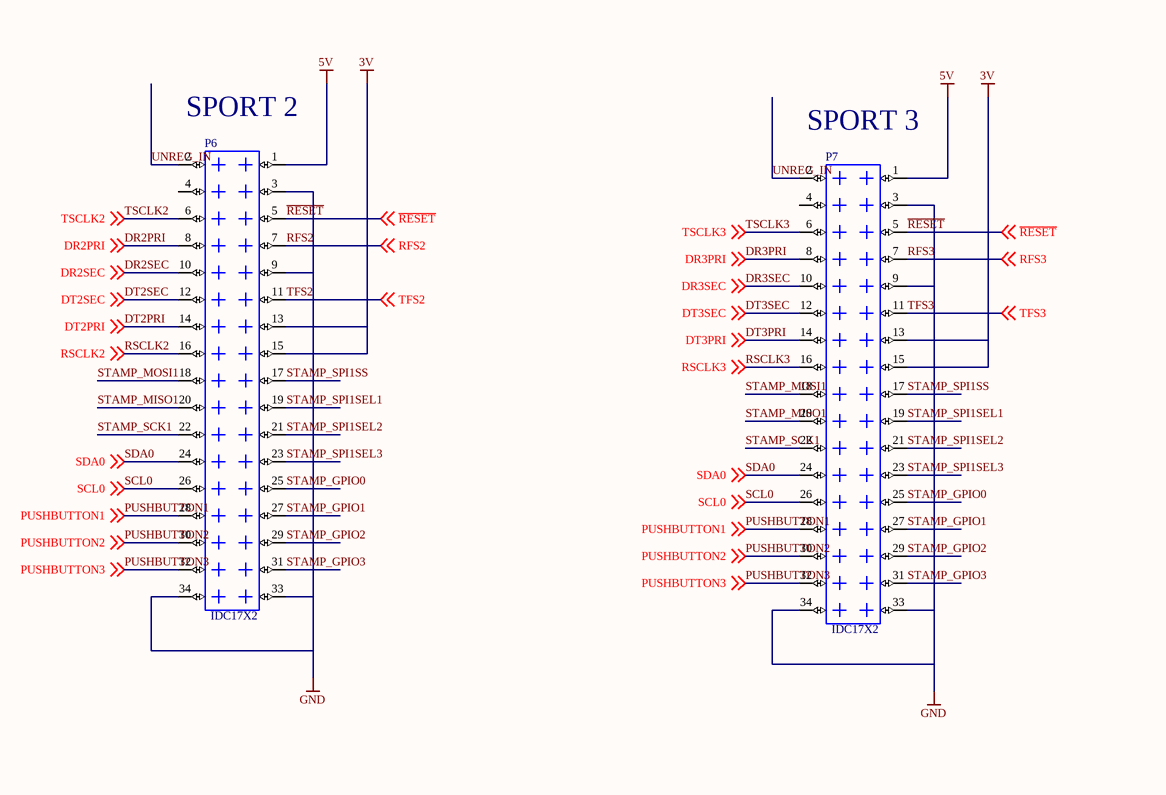
[diagram p49: a0206-2006.15.SchDoc, top left]
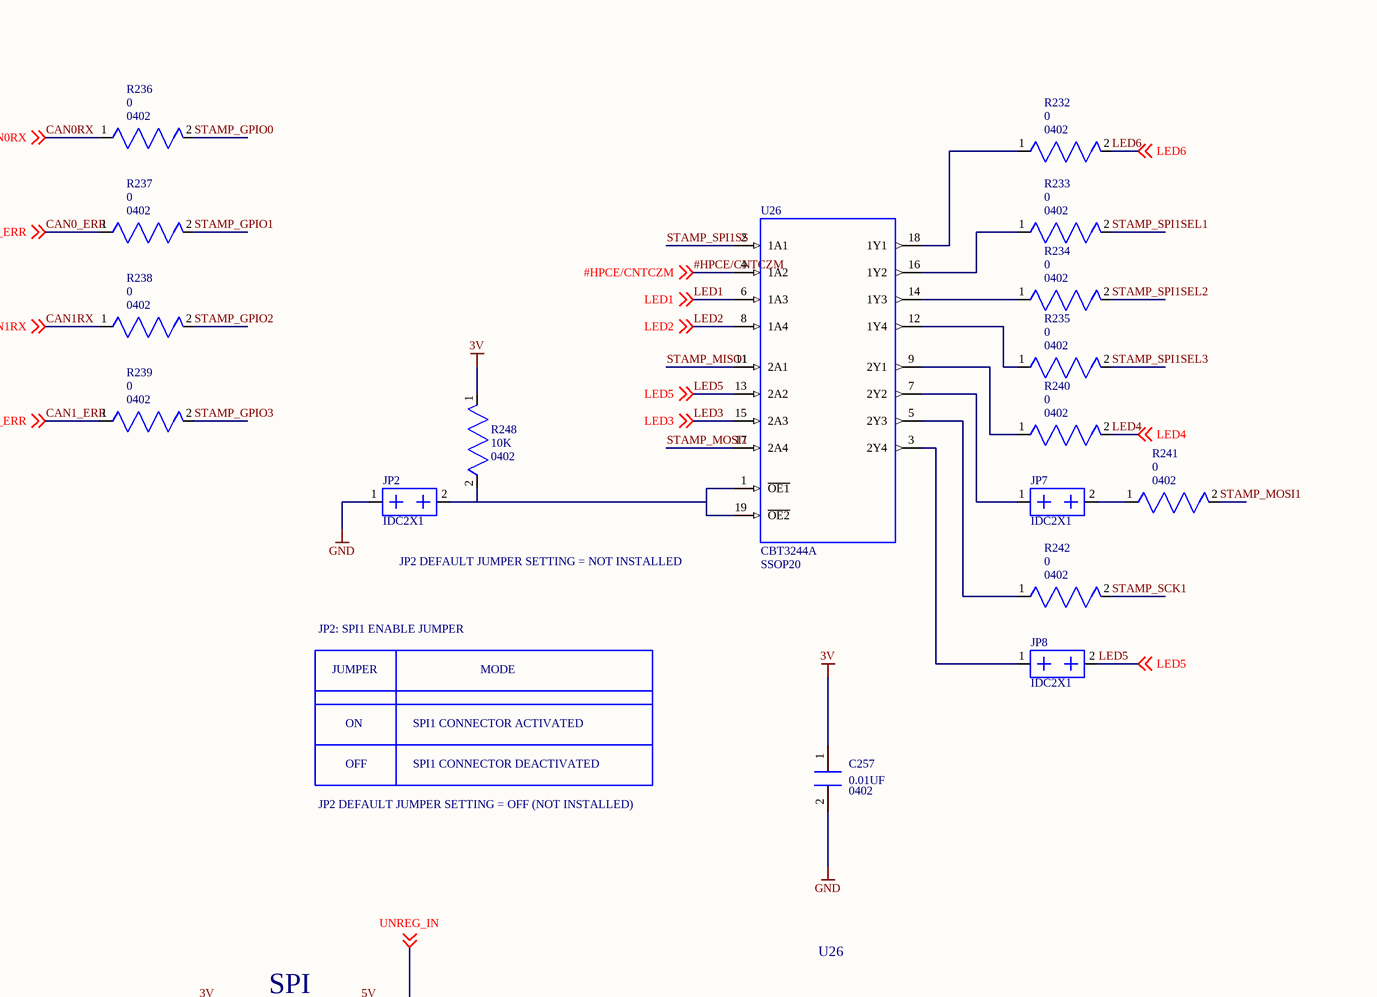
[diagram p50: a0206-2006.15.SchDoc, top right]
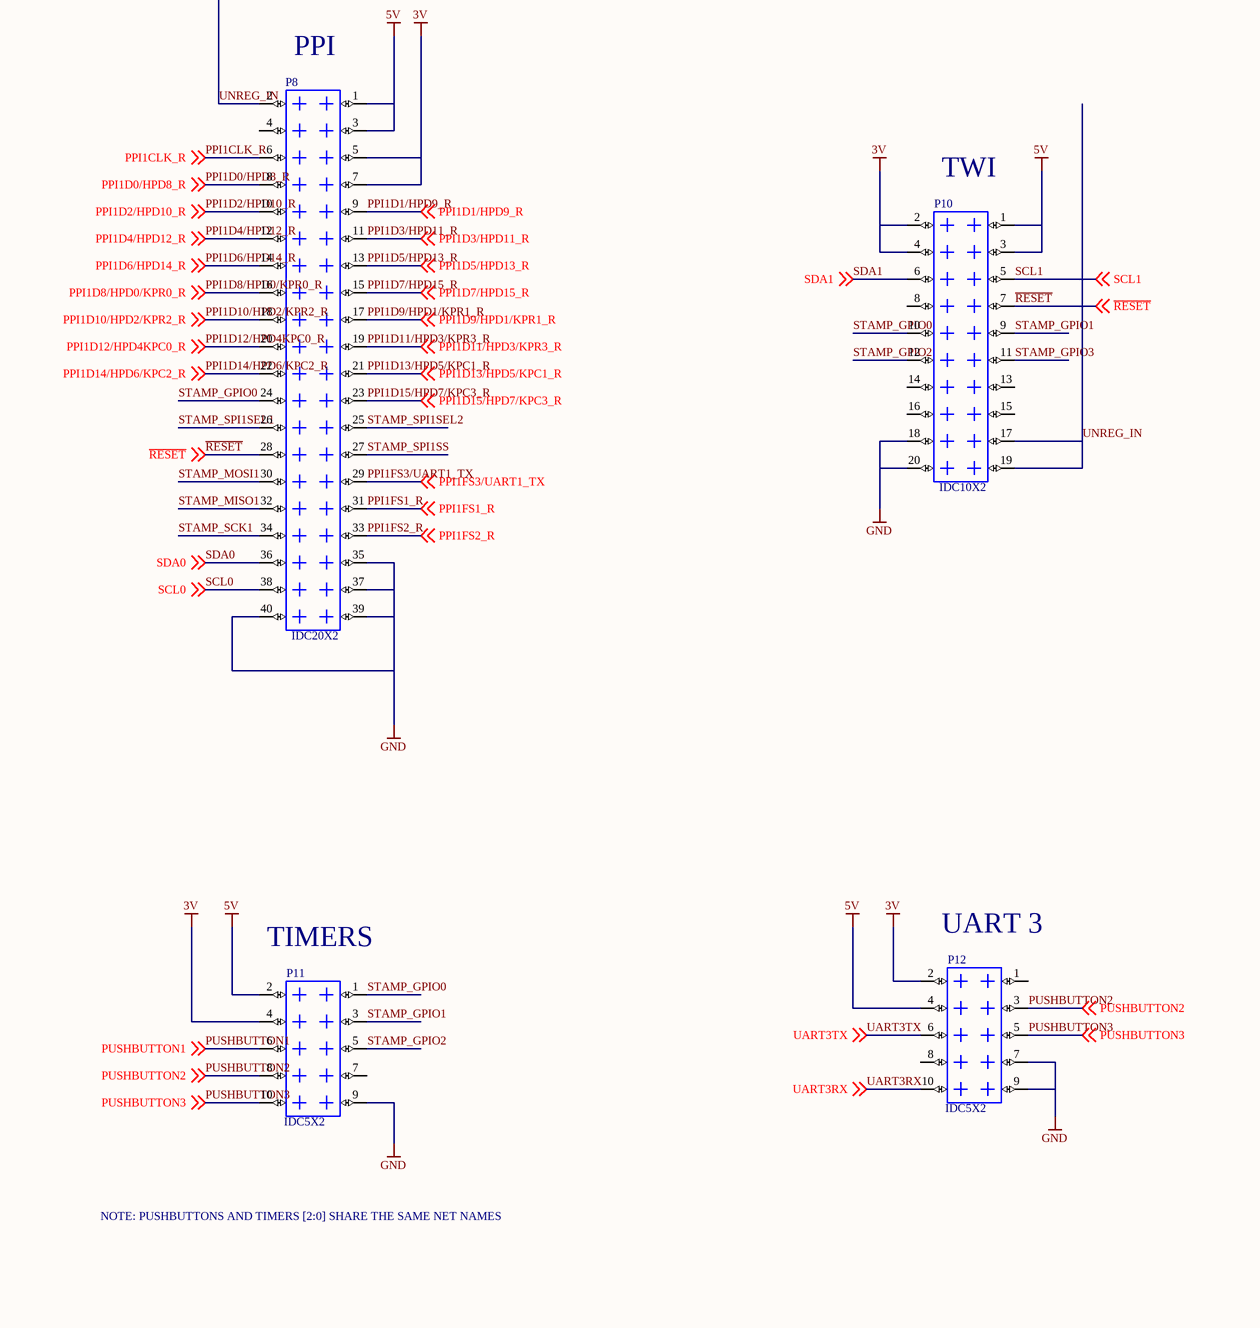
[diagram p51: a0206-2006.15.SchDoc, bottom left]
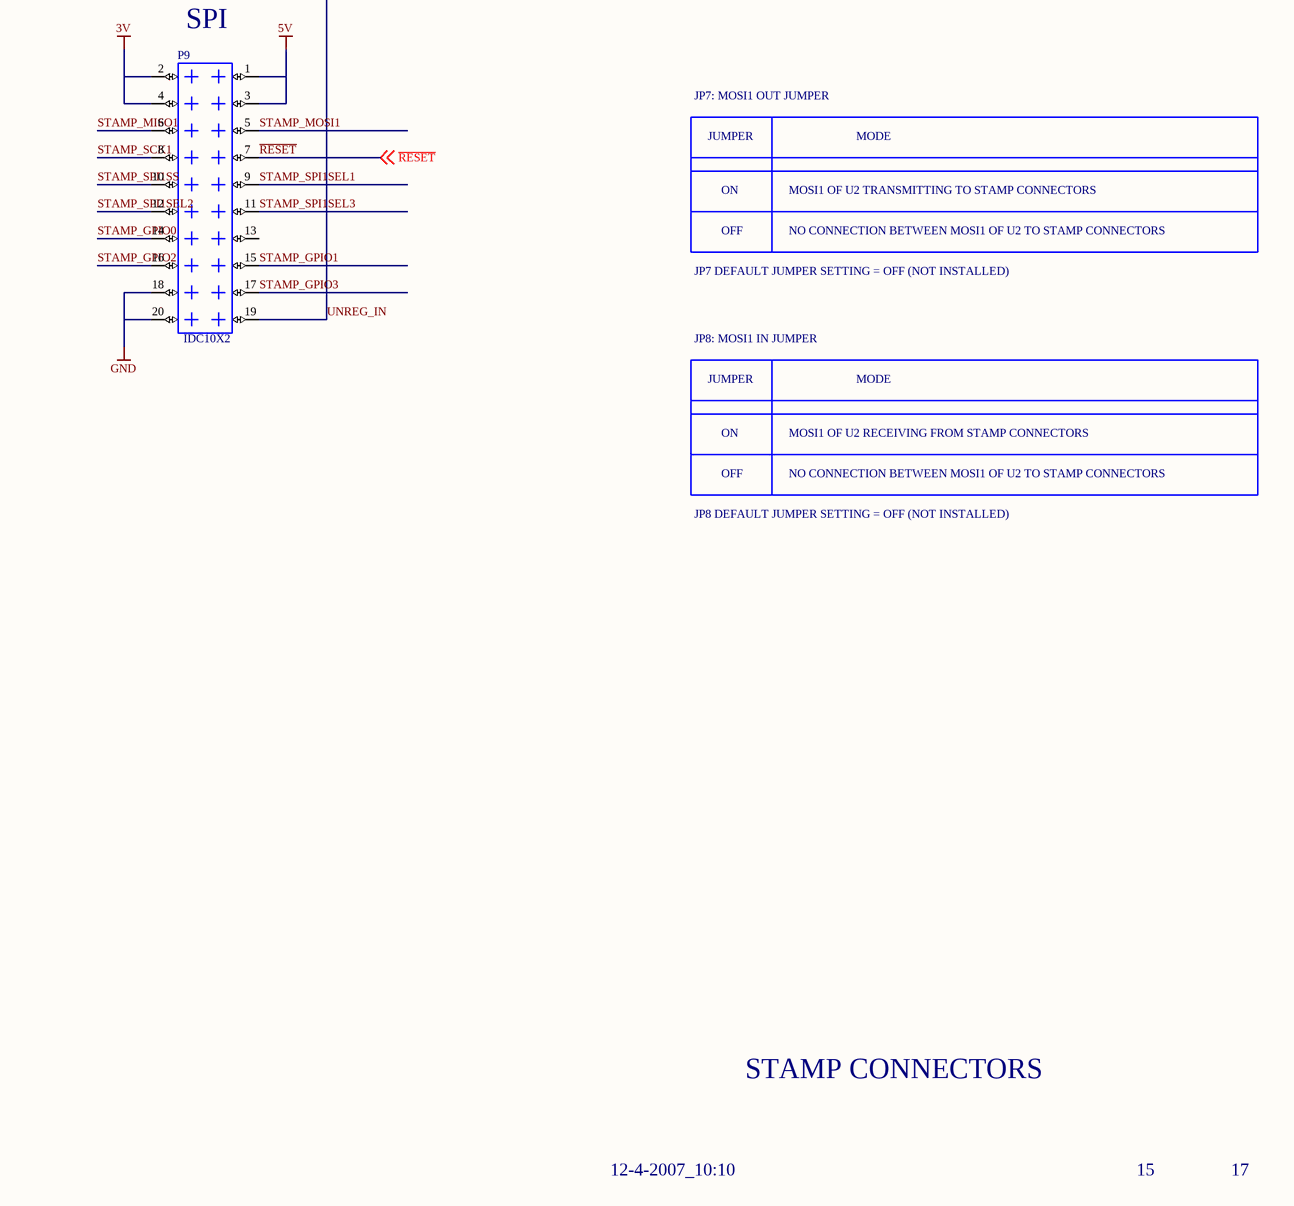
[diagram p52: a0206-2006.15.SchDoc, bottom right]

### Parts
C257  value 0.01UF  [0402]  (hidden comment: *)
JP2  *  [IDC2X1]  (value not drawn)
JP7  *  [IDC2X1]  (value not drawn)
JP8  *  [IDC2X1]  (value not drawn)
P6  *  [IDC17X2]  (value not drawn)
P7  *  [IDC17X2]  (value not drawn)
P8  *  [IDC20X2]  (value not drawn)
P9  *  [IDC10X2]  (value not drawn)
P10  *  [IDC10X2]  (value not drawn)
P11  *  [IDC5X2]  (value not drawn)
P12  *  [IDC5X2]  (value not drawn)
R232  value 0  [0402]  (hidden comment: *)
R233  value 0  [0402]  (hidden comment: *)
R234  value 0  [0402]  (hidden comment: *)
R235  value 0  [0402]  (hidden comment: *)
R236  value 0  [0402]  (hidden comment: *)
R237  value 0  [0402]  (hidden comment: *)
R238  value 0  [0402]  (hidden comment: *)
R239  value 0  [0402]  (hidden comment: *)
R240  value 0  [0402]  (hidden comment: *)
R241  value 0  [0402]  (hidden comment: *)
R242  value 0  [0402]  (hidden comment: *)
R248  value 10K  [0402]  (hidden comment: *)
U26  PART: CBT3244A  [SSOP20]  (hidden comment: *)

### Nets
3V: C257.1(A) P6.13 P6.15 P7.13 P7.15 P8.5 P8.7 P9.2 P9.4 P10.2 P10.4 P11.4 P12.2 R248.1(N1) U26.20(3V)
5V: P6.1 P7.1 P8.1 P8.3 P9.1 P9.3 P10.1 P10.3 P11.2 P12.4
GND: C257.2(B) JP2.1 P6.3 P6.9 P6.33 P6.34 P7.3 P7.9 P7.33 P7.34 P8.35 P8.37 P8.39 P8.40 P9.18 P9.20 P10.18 P10.20 P11.9 P12.7 P12.9 U26.10(GND)
#HPCE/CNTCZM: U26.4(1A2) ; off-sheet #HPCE/CNTCZM
CAN0_ERR: R237.1(N1) ; off-sheet CAN0_ERR
CAN0RX: R236.1(N1) ; off-sheet CAN0RX
CAN1_ERR: R239.1(N1) ; off-sheet CAN1_ERR
CAN1RX: R238.1(N1) ; off-sheet CAN1RX
DR2PRI: P6.8 ; off-sheet DR2PRI
DR2SEC: P6.10 ; off-sheet DR2SEC
DR3PRI: P7.8 ; off-sheet DR3PRI
DR3SEC: P7.10 ; off-sheet DR3SEC
DT2PRI: P6.14 ; off-sheet DT2PRI
DT2SEC: P6.12 ; off-sheet DT2SEC
DT3PRI: P7.14 ; off-sheet DT3PRI
DT3SEC: P7.12 ; off-sheet DT3SEC
LED1: U26.6(1A3) ; off-sheet LED1
LED2: U26.8(1A4) ; off-sheet LED2
LED3: U26.15(2A3) ; off-sheet LED3
LED4: R240.2(N2) ; off-sheet LED4
LED5: JP8.2 U26.13(2A2) ; off-sheet LED5
LED6: R232.2(N2) ; off-sheet LED6
PPI1CLK_R: P8.6 ; off-sheet PPI1CLK_R
PPI1D0/HPD8_R: P8.8 ; off-sheet PPI1D0/HPD8_R
PPI1D1/HPD9_R: P8.9 ; off-sheet PPI1D1/HPD9_R
PPI1D2/HPD10_R: P8.10 ; off-sheet PPI1D2/HPD10_R
PPI1D3/HPD11_R: P8.11 ; off-sheet PPI1D3/HPD11_R
PPI1D4/HPD12_R: P8.12 ; off-sheet PPI1D4/HPD12_R
PPI1D5/HPD13_R: P8.13 ; off-sheet PPI1D5/HPD13_R
PPI1D6/HPD14_R: P8.14 ; off-sheet PPI1D6/HPD14_R
PPI1D7/HPD15_R: P8.15 ; off-sheet PPI1D7/HPD15_R
PPI1D8/HPD0/KPR0_R: P8.16 ; off-sheet PPI1D8/HPD0/KPR0_R
PPI1D9/HPD1/KPR1_R: P8.17 ; off-sheet PPI1D9/HPD1/KPR1_R
PPI1D10/HPD2/KPR2_R: P8.18 ; off-sheet PPI1D10/HPD2/KPR2_R
PPI1D11/HPD3/KPR3_R: P8.19 ; off-sheet PPI1D11/HPD3/KPR3_R
PPI1D12/HPD4KPC0_R: P8.20 ; off-sheet PPI1D12/HPD4KPC0_R
PPI1D13/HPD5/KPC1_R: P8.21 ; off-sheet PPI1D13/HPD5/KPC1_R
PPI1D14/HPD6/KPC2_R: P8.22 ; off-sheet PPI1D14/HPD6/KPC2_R
PPI1D15/HPD7/KPC3_R: P8.23 ; off-sheet PPI1D15/HPD7/KPC3_R
PPI1FS1_R: P8.31 ; off-sheet PPI1FS1_R
PPI1FS2_R: P8.33 ; off-sheet PPI1FS2_R
PPI1FS3/UART1_TX: P8.29 ; off-sheet PPI1FS3/UART1_TX
PUSHBUTTON1: P6.28 P7.28 P11.6 ; off-sheet PUSHBUTTON1
PUSHBUTTON2: P6.30 P7.30 P11.8 P12.3 ; off-sheet PUSHBUTTON2
PUSHBUTTON3: P6.32 P7.32 P11.10 P12.5 ; off-sheet PUSHBUTTON3
~{RESET}: P6.5 P7.5 P8.28 P9.7 P10.7 ; off-sheet ~{RESET}
RFS2: P6.7 ; off-sheet RFS2
RFS3: P7.7 ; off-sheet RFS3
RSCLK2: P6.16 ; off-sheet RSCLK2
RSCLK3: P7.16 ; off-sheet RSCLK3
SCL0: P6.26 P7.26 P8.38 ; off-sheet SCL0
SCL1: P10.5 ; off-sheet SCL1
SDA0: P6.24 P7.24 P8.36 ; off-sheet SDA0
SDA1: P10.6 ; off-sheet SDA1
STAMP_GPIO0: P6.25 P7.25 P8.24 P9.14 P10.10 P11.1 R236.2(N2)
STAMP_GPIO1: P6.27 P7.27 P9.15 P10.9 P11.3 R237.2(N2)
STAMP_GPIO2: P6.29 P7.29 P9.16 P10.12 P11.5 R238.2(N2)
STAMP_GPIO3: P6.31 P7.31 P9.17 P10.11 R239.2(N2)
STAMP_MISO1: P6.20 P7.20 P8.32 P9.6 U26.11(2A1)
STAMP_MOSI1: P6.18 P7.18 P8.30 P9.5 R241.2(N2) U26.17(2A4)
STAMP_SCK1: P6.22 P7.22 P8.34 P9.8 R242.2(N2)
STAMP_SPI1SEL1: P6.19 P7.19 P8.26 P9.9 R233.2(N2)
STAMP_SPI1SEL2: P6.21 P7.21 P8.25 P9.12 R234.2(N2)
STAMP_SPI1SEL3: P6.23 P7.23 P9.11 R235.2(N2)
STAMP_SPI1SS: P6.17 P7.17 P8.27 P9.10 U26.2(1A1)
TFS2: P6.11 ; off-sheet TFS2
TFS3: P7.11 ; off-sheet TFS3
TSCLK2: P6.6 ; off-sheet TSCLK2
TSCLK3: P7.6 ; off-sheet TSCLK3
UART3RX: P12.10 ; off-sheet UART3RX
UART3TX: P12.6 ; off-sheet UART3TX
UNREG_IN: P6.2 P7.2 P8.2 P9.19 P10.17 P10.19 ; off-sheet UNREG_IN
NetJP2_2: JP2.2 R248.2(N2) U26.1(~{OE1}) U26.19(~{OE2})
NetJP7_1: JP7.1 U26.7(2Y2)
NetJP7_2: JP7.2 R241.1(N1)
NetJP8_1: JP8.1 U26.3(2Y4)
NetR232_1: R232.1(N1) U26.18(1Y1)
NetR233_1: R233.1(N1) U26.16(1Y2)
NetR234_1: R234.1(N1) U26.14(1Y3)
NetR235_1: R235.1(N1) U26.12(1Y4)
NetR240_1: R240.1(N1) U26.9(2Y1)
NetR242_1: R242.1(N1) U26.5(2Y3)

Not connected (* = marked no-connect by the designer): P6 4; P7 4; P8 4; P9 13; P10 8 13 14 15 16; P11 7; P12 1 8

### Notes on the sheet
- (near P6) SPORT 2
- (near P7) SPORT 3
- JP2 DEFAULT JUMPER SETTING = NOT INSTALLED
- JP2: SPI1 ENABLE JUMPER
- JUMPER
- MODE
- ON
- SPI1 CONNECTOR ACTIVATED
- JP2 DEFAULT JUMPER SETTING = OFF (NOT INSTALLED)
- OFF
- SPI1 CONNECTOR DEACTIVATED
- (near P8) PPI
- (near P10) TWI
- (near P9) SPI
- U26
- JP7: MOSI1 OUT JUMPER
- NO CONNECTION BETWEEN MOSI1 OF U2 TO STAMP CONNECTORS
- MOSI1 OF U2 TRANSMITTING TO STAMP CONNECTORS
- JP7 DEFAULT JUMPER SETTING = OFF (NOT INSTALLED)
- JP8: MOSI1 IN JUMPER
- MOSI1 OF U2 RECEIVING FROM STAMP CONNECTORS
- JP8 DEFAULT JUMPER SETTING = OFF (NOT INSTALLED)
- (near P11) TIMERS
- (near P12) UART 3
- NOTE: PUSHBUTTONS AND TIMERS [2:0] SHARE THE SAME NET NAMES
- STAMP CONNECTORS
- 12-4-2007_10:10
- 15
- 17
- A
- B
- C
- D
- 1
- 2
- 3
- 20 Cotton Road
- 4
- DEVICES
- ANALOG
- Nashua, NH 03063
- PH: 1-800-ANALOGD
- Title
- ADSP-BF548 EZ-KIT LITE
- Size
- Board No.
- A0206-2006
- Rev
- 1.4B
- Date
- Sheet
- of

### Library data of the parts
C257 = CAP_NON_POLARIZED.2: as C184 on sheet a0206-2006.13; PKG_TYPE: 0402; ROHS: ROHS
JP2 JP8 = CON_2X1.2: HEADER; PART_SPEC: CONNECTOR; LEVEL: STD; PRT_NUM: 6000774; CONFIGURATION: 2X1; PKG_TYPE: IDC2X1; TYPE: IDC; ROHS: ROHS
JP7 = CON_2X1.2: HEADER; PART_SPEC: CONNECTOR; LEVEL: STD; CONFIGURATION: 2X1; PRT_NUM: 6000774; PKG_TYPE: IDC2X1; ROHS: ROHS; TYPE: IDC
P6 = CON_17X2.1: HEADER; PART_SPEC: CONNECTOR; LEVEL: STD; CONFIGURATION: 17X2; BOARDS: BOTH; PRT_NUM: 6000779; PKG_TYPE: IDC17X2; ROHS: ROHS; TYPE: IDC
P7 = CON_17X2.1: HEADER; PART_SPEC: CONNECTOR; LEVEL: STD; PRT_NUM: 6000779; BOARDS: BOTH; CONFIGURATION: 17X2; PKG_TYPE: IDC17X2; TYPE: IDC; ROHS: ROHS
P8 = CON_20X2.1: HEADER; PART_SPEC: CONNECTOR; LEVEL: STD; CONFIGURATION: 20X2; BOARDS: BOTH; PRT_NUM: 6000780; PKG_TYPE: IDC20X2; ROHS: ROHS; TYPE: IDC
P9 P10 = CON_10X2.1: HEADER; PART_SPEC: CONNECTOR; LEVEL: STD; CONFIGURATION: 10X2; BOARDS: BOTH; PRT_NUM: 6000778; PKG_TYPE: IDC10X2; ROHS: ROHS; TYPE: IDC
P11 P12 = CON_5X2.1: HEADER; PART_SPEC: CONNECTOR; LEVEL: STD; CONFIGURATION: 5X2; BOARDS: BOTH; PRT_NUM: 6000776; PKG_TYPE: IDC5X2; ROHS: ROHS; TYPE: IDC
R232 R234 R237 R239 R240 R242 = RES_STANDARD.1: PART_SPEC: RESISTOR; LEVEL: STD; PRT_NUM: 7000282; POWER: 1/16W; TOLERANCE: 5%; PKG_TYPE: 0402; ROHS: ROHS
R233 R235 R236 R238 R241 = RES_STANDARD.1: PART_SPEC: RESISTOR; LEVEL: STD; TOLERANCE: 5%; POWER: 1/16W; PRT_NUM: 7000282; PKG_TYPE: 0402; ROHS: ROHS
R248 = RES_STANDARD.2: PART_SPEC: RESISTOR; LEVEL: STD; PRT_NUM: 7000280; POWER: 1/16W; TOLERANCE: 5%; PKG_TYPE: 0402; ROHS: ROHS
U26 = ICS_SN74XXX244.1: OCTAL BUS SWITCH; LEVEL: STD; PRT_NUM: 1000450; PKG_TYPE: SSOP20; WEB: http://www.nxp.com/#/pip/cb; ROHS: ROHS

## Sheet a0206-2006.16.SchDoc
size 558 x 431 mm
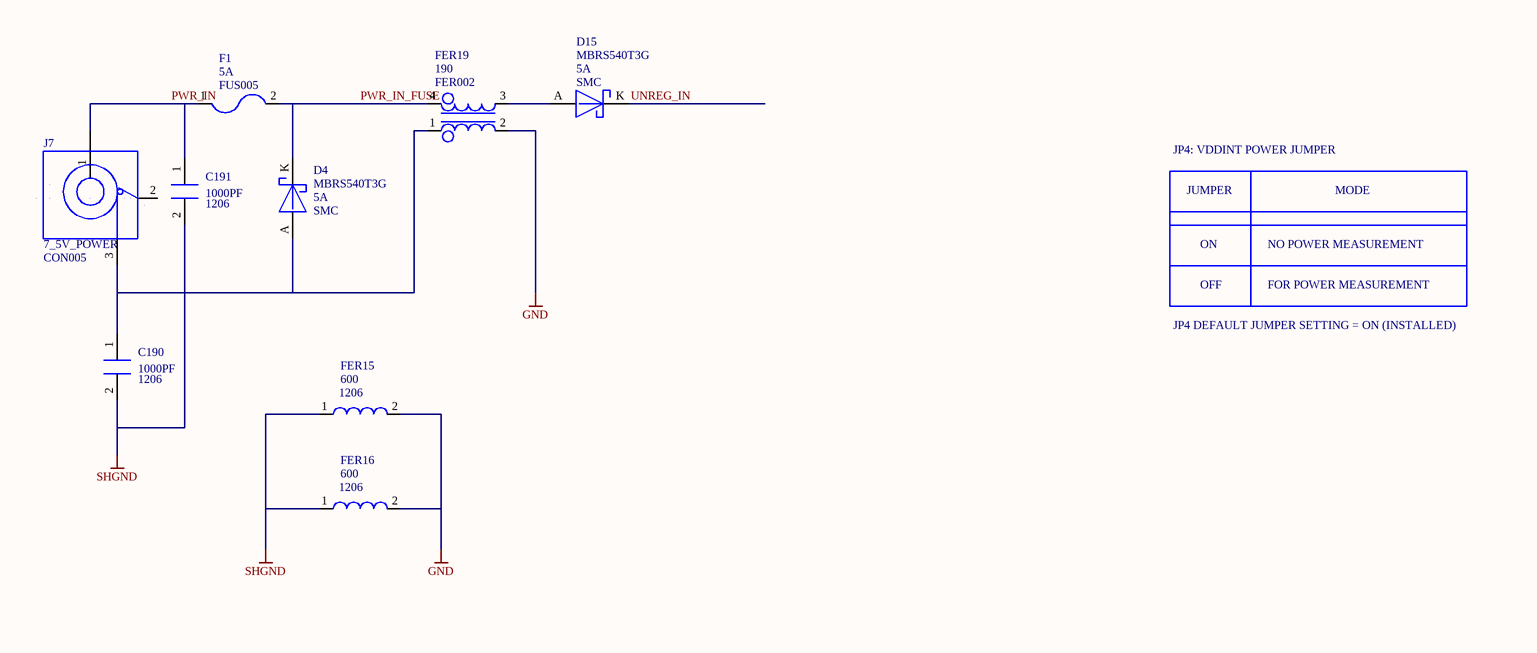
[diagram p53: a0206-2006.16.SchDoc, top left]
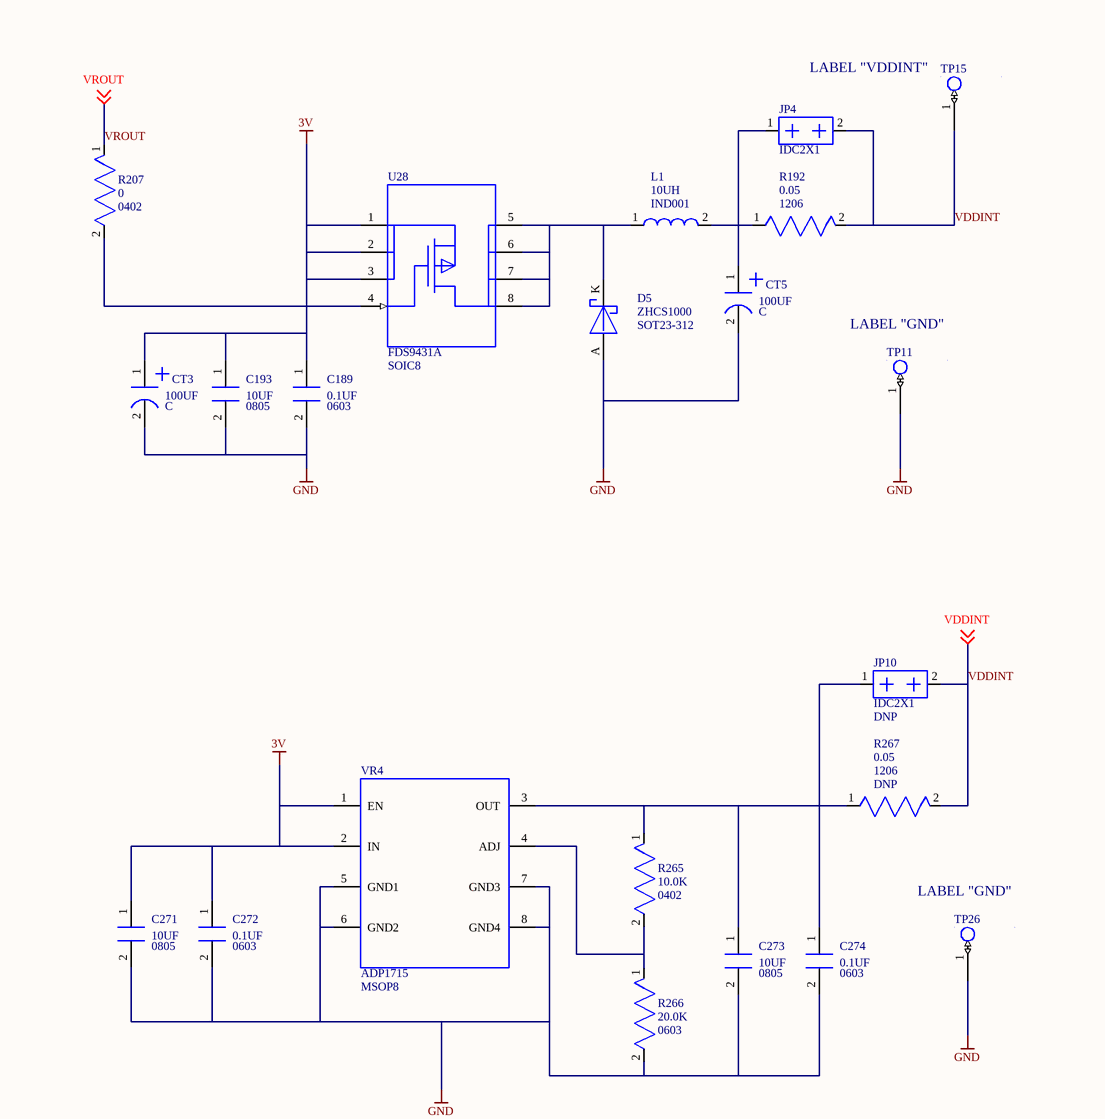
[diagram p54: a0206-2006.16.SchDoc, top right]
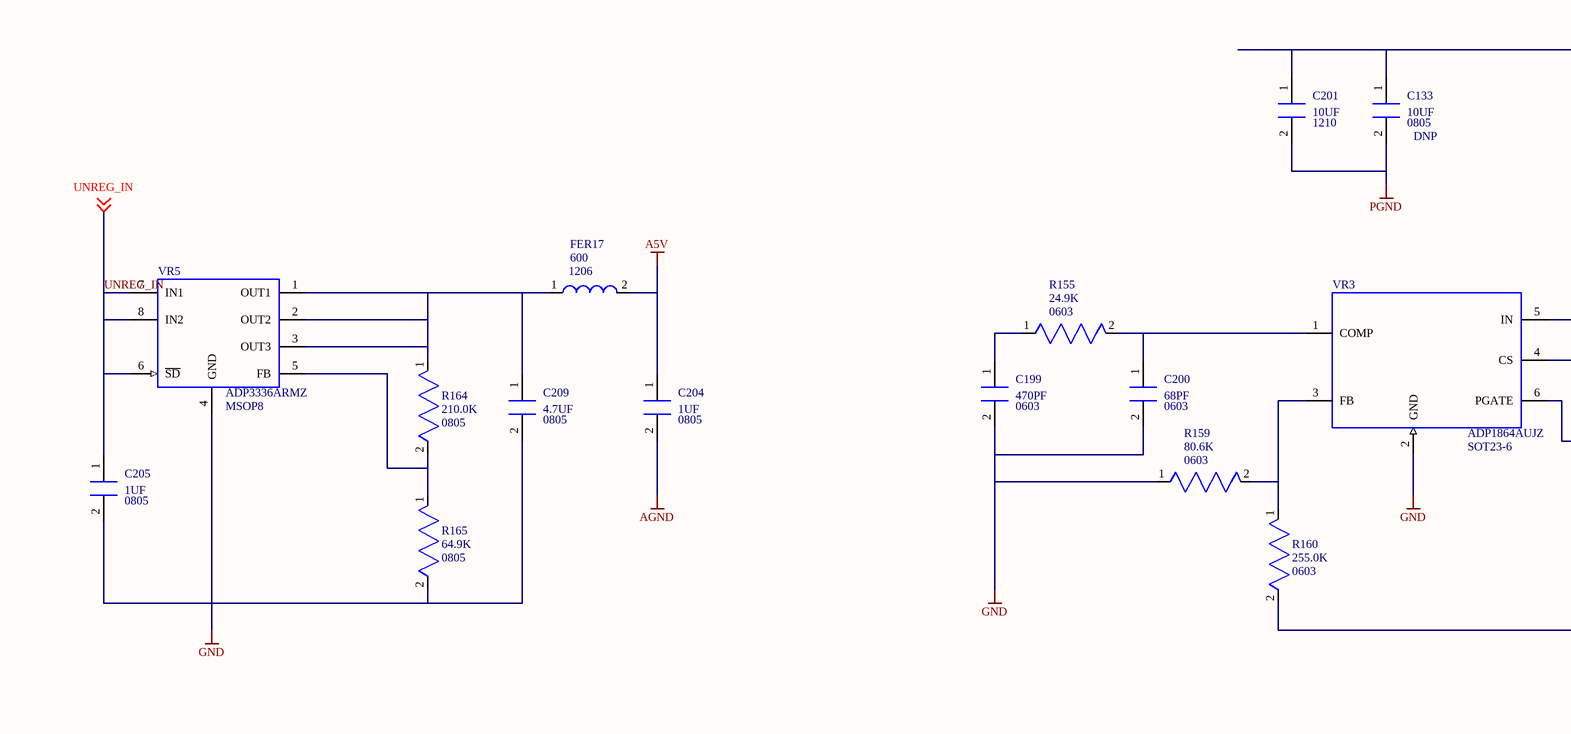
[diagram p55: a0206-2006.16.SchDoc, bottom left]
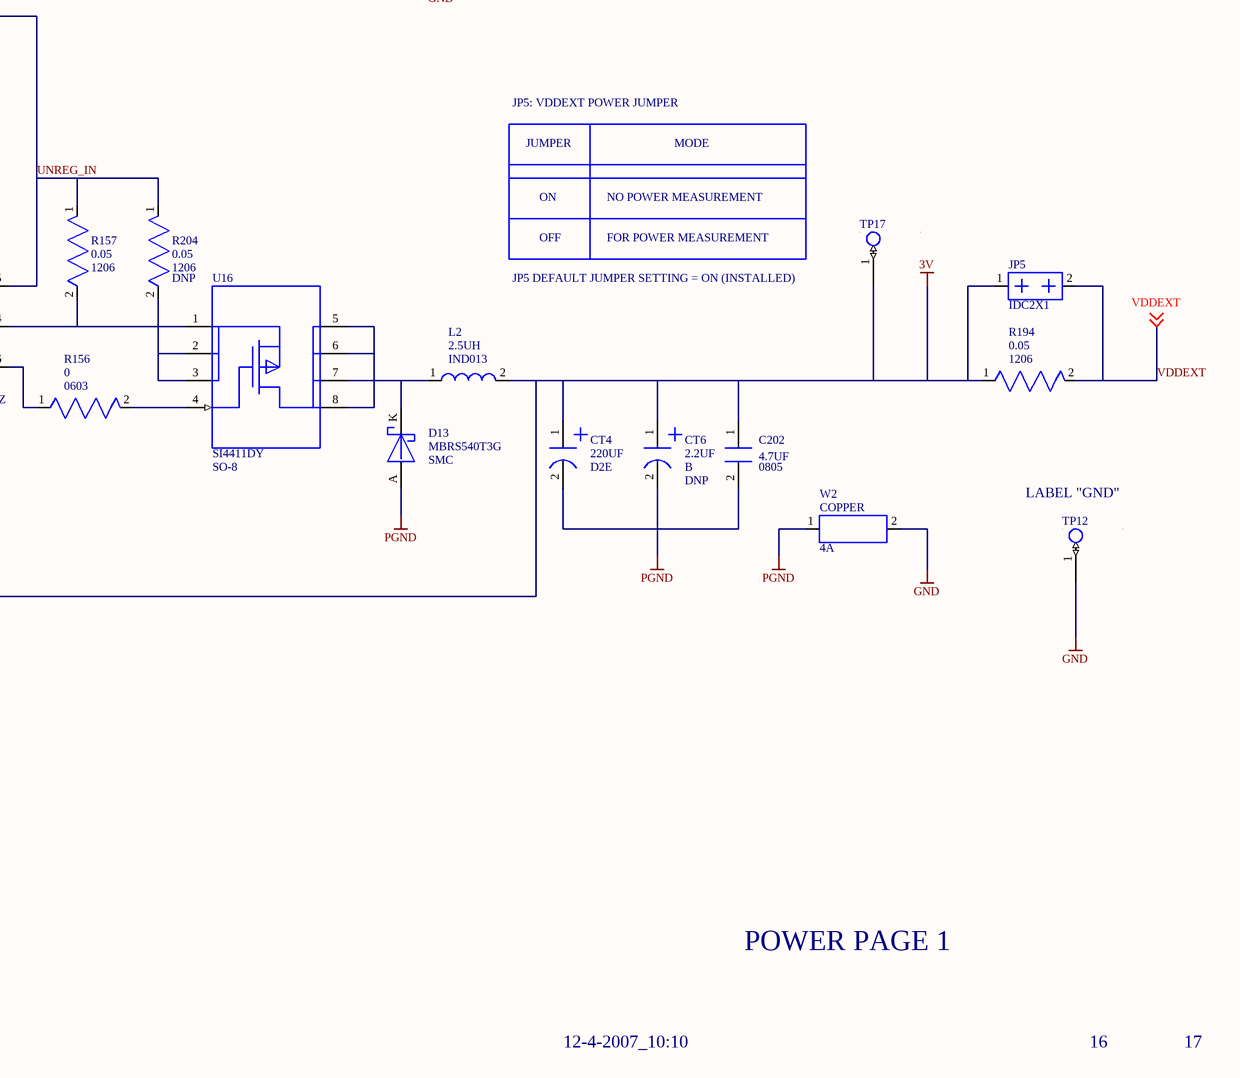
[diagram p56: a0206-2006.16.SchDoc, bottom right]

### Parts
C133  value 10UF  CLASS: DNP  [0805]  (hidden comment: *)
C189  value 0.1UF  [0603]  (hidden comment: *)
C190  value 1000PF  [1206]  (hidden comment: *)
C191  value 1000PF  [1206]  (hidden comment: *)
C193  value 10UF  [0805]  (hidden comment: *)
C199  value 470PF  [0603]  (hidden comment: *)
C200  value 68PF  [0603]  (hidden comment: *)
C201  value 10UF  [1210]  (hidden comment: *)
C202  value 4.7UF  [0805]  (hidden comment: *)
C204  value 1UF  [0805]  (hidden comment: *)
C205  value 1UF  [0805]  (hidden comment: *)
C209  value 4.7UF  [0805]  (hidden comment: *)
C271  value 10UF  [0805]  (hidden comment: *)
C272  value 0.1UF  [0603]  (hidden comment: *)
C273  value 10UF  [0805]  (hidden comment: *)
C274  value 0.1UF  [0603]  (hidden comment: *)
CT3  value 100UF  [C]  (hidden comment: *)
CT4  value 220UF  [D2E]  (hidden comment: *)
CT5  value 100UF  [C]  (hidden comment: *)
CT6  value 2.2UF  CLASS: DNP  [B]  (hidden comment: *)
D4  value 5A  PART: MBRS540T3G  [SMC]  (hidden comment: *)
D5  PART: ZHCS1000  [SOT23-312]  (hidden comment: *)
D13  PART: MBRS540T3G  [SMC]  (hidden comment: *)
D15  value 5A  PART: MBRS540T3G  [SMC]  (hidden comment: *)
F1  value 5A  [FUS005]  (hidden comment: *)
FER15  value 600  [1206]  (hidden comment: *)
FER16  value 600  [1206]  (hidden comment: *)
FER17  value 600  [1206]  (hidden comment: *)
FER19  value 190  [FER002]  (hidden comment: *)
J7  value 7_5V_POWER  [CON005]  (hidden comment: *)
JP4  *  [IDC2X1]  (value not drawn)
JP5  *  [IDC2X1]  (value not drawn)
JP10  CLASS: DNP  [IDC2X1]  (hidden comment: *)
L1  value 10UH  [IND001]  (hidden comment: *)
L2  value 2.5UH  [IND013]  (hidden comment: *)
R155  value 24.9K  [0603]  (hidden comment: *)
R156  value 0  [0603]  (hidden comment: *)
R157  value 0.05  [1206]  (hidden comment: *)
R159  value 80.6K  [0603]  (hidden comment: *)
R160  value 255.0K  [0603]  (hidden comment: *)
R164  value 210.0K  [0805]  (hidden comment: *)
R165  value 64.9K  [0805]  (hidden comment: *)
R192  value 0.05  [1206]  (hidden comment: *)
R194  value 0.05  [1206]  (hidden comment: *)
R204  value 0.05  CLASS: DNP  [1206]  (hidden comment: *)
R207  value 0  [0402]  (hidden comment: *)
R265  value 10.0K  [0402]  (hidden comment: *)
R266  value 20.0K  [0603]  (hidden comment: *)
R267  value 0.05  CLASS: DNP  [1206]  (hidden comment: *)
TP11  *  [TP]  (value not drawn)
TP12  *  [TP]  (value not drawn)
TP15  *  [TP]  (value not drawn)
TP17  *  [TP]  (value not drawn)
TP26  *  [TP]  (value not drawn)
U16  PART: SI4411DY  [SO-8]  (hidden comment: *)
U28  PART: FDS9431A  [SOIC8]  (hidden comment: *)
VR3  PART: ADP1864AUJZ  [SOT23-6]  (hidden comment: *)
VR4  PART: ADP1715  [MSOP8]  (hidden comment: *)
VR5  PART: ADP3336ARMZ  [MSOP8]  (hidden comment: *)
W2  value COPPER  [4A]  (hidden comment: *)

### Nets
3V: C189.1(A) C193.1(A) C202.1(A) C271.1(A) C272.1(A) CT3.1(P) CT4.1(P) CT6.1(P) JP5.1 L2.2(B) R160.2(N2) R194.1(N1) TP17.1(TP) U28.1(S1) U28.2(S2) U28.3(S3) VR4.1(EN) VR4.2(IN)
A5V: C204.1(A) FER17.2(B)
AGND: C204.2(B)
GND: C189.2(B) C193.2(B) C199.2(B) C200.2(B) C205.2(B) C209.2(B) C271.2(B) C272.2(B) C273.2(B) C274.2(B) CT3.2(N) CT5.2(N) D5.A(ANODE) FER15.2(B) FER16.2(B) FER19.2 R159.1(N1) R165.2(N2) R266.2(N2) TP11.1(TP) TP12.1(TP) TP26.1(TP) VR3.2(GND) VR4.5(GND1) VR4.6(GND2) VR4.7(GND3) VR4.8(GND4) VR5.4(GND) W2.2(N2)
PGND: C133.2(B) C201.2(B) C202.2(B) CT4.2(N) CT6.2(N) D13.A(ANODE) W2.1(N1)
SHGND: C190.2(B) C191.2(B) FER15.1(A) FER16.1(A)
PWR_IN: C191.1(A) F1.1(A) J7.1(CENTER)
PWR_IN_FUSE: D4.K(CATHODE) F1.2(B) FER19.4
UNREG_IN: C133.1(A) C201.1(A) C205.1(A) D15.K(CATHODE) R157.1(N1) R204.1(N1) VR3.5(IN) VR5.6(~{SD}) VR5.7(IN1) VR5.8(IN2) ; off-sheet UNREG_IN
VDDEXT: JP5.2 R194.2(N2) ; off-sheet VDDEXT
VDDINT: JP4.2 JP10.2 R192.2(N2) R267.2(N2) TP15.1(TP) ; off-sheet VDDINT
VROUT: R207.1(N1) ; off-sheet VROUT
NetC190_1: C190.1(A) D4.A(ANODE) FER19.1 J7.3(SHELL)
NetC199_1: C199.1(A) R155.1(N1)
NetC200_1: C200.1(A) R155.2(N2) VR3.1(COMP)
NetC209_1: C209.1(A) FER17.1(A) R164.1(N1) VR5.1(OUT1) VR5.2(OUT2) VR5.3(OUT3)
NetC273_1: C273.1(A) C274.1(A) JP10.1 R265.1(N1) R267.1(N1) VR4.3(OUT)
NetCT5_1: CT5.1(P) JP4.1 L1.2(B) R192.1(N1)
NetD5_K: D5.K(CATHODE) L1.1(A) U28.5(D1) U28.6(D2) U28.7(D3) U28.8(D4)
NetD13_K: D13.K(CATHODE) L2.1(A) U16.5(D1) U16.6(D2) U16.7(D3) U16.8(D4)
NetD15_A: D15.A(ANODE) FER19.3
NetR156_1: R156.1(N1) VR3.6(PGATE)
NetR156_2: R156.2(N2) U16.4(G)
NetR157_2: R157.2(N2) R204.2(N2) U16.1(S1) U16.2(S2) U16.3(S3) VR3.4(CS)
NetR159_2: R159.2(N2) R160.1(N1) VR3.3(FB)
NetR164_2: R164.2(N2) R165.1(N1) VR5.5(FB)
NetR207_2: R207.2(N2) U28.4(G)
NetR265_2: R265.2(N2) R266.1(N1) VR4.4(ADJ)

Not connected (* = marked no-connect by the designer): J7 2(N/C)

### Notes on the sheet
- LABEL "VDDINT"
- JP4: VDDINT POWER JUMPER
- JUMPER
- MODE
- OFF
- ON
- NO POWER MEASUREMENT
- FOR POWER MEASUREMENT
- JP4 DEFAULT JUMPER SETTING = ON (INSTALLED)
- (near TP11) LABEL "GND"
- (near TP26) LABEL "GND"
- JP5: VDDEXT POWER JUMPER
- JP5 DEFAULT JUMPER SETTING = ON (INSTALLED)
- (near TP12) LABEL "GND"
- POWER PAGE 1
- 12-4-2007_10:10
- 16
- 17
- A
- B
- C
- D
- 1
- 2
- 3
- 20 Cotton Road
- 4
- DEVICES
- ANALOG
- Nashua, NH 03063
- PH: 1-800-ANALOGD
- Title
- ADSP-BF548 EZ-KIT LITE
- Size
- Board No.
- A0206-2006
- Rev
- 1.4B
- Date
- Sheet
- of

### Library data of the parts
C133 C193 C273 = CAP_NON_POLARIZED.2: PART_SPEC: CAPACITOR; LEVEL: STD; TOLERANCE: 10%; VOLTAGE: 10V; TYPE: X5R CER; PRT_NUM: 7000461; PKG_TYPE: 0805; ROHS: ROHS
C189 C272 C274 = CAP_NON_POLARIZED.2: PART_SPEC: CAPACITOR; LEVEL: STD; TYPE: X7R; BOARDS: BOTH; PRT_NUM: 7000340; VOLTAGE: 16V; TOLERANCE: 10%; PKG_TYPE: 0603; ROHS: ROHS
C190 C191 = CAP_NON_POLARIZED.2: PART_SPEC: CAPACITOR; LEVEL: STD; TYPE: CERM; PRT_NUM: 7000502; VOLTAGE: 50V; TOLERANCE: 5%; PKG_TYPE: 1206; ROHS: ROHS
C199 = CAP_NON_POLARIZED.2: PART_SPEC: CAPACITOR; LEVEL: STD; TOLERANCE: 5%; VOLTAGE: 50V; TYPE: NPO; PRT_NUM: 7000352; PKG_TYPE: 0603; ROHS: ROHS
C200 = CAP_NON_POLARIZED.2: PART_SPEC: CAPACITOR; LEVEL: STD; TOLERANCE: 5%; VOLTAGE: 50V; TYPE: NPO; PRT_NUM: 7000348; PKG_TYPE: 0603; ROHS: ROHS
C201 = CAP_NON_POLARIZED.2: PART_SPEC: CAPACITOR; LEVEL: STD; TOLERANCE: 10%; VOLTAGE: 16V; TYPE: X5R; PRT_NUM: 7000492; PKG_TYPE: 1210; ROHS: ROHS
C202 = CAP_NON_POLARIZED.2: PART_SPEC: CAPACITOR; LEVEL: STD; TOLERANCE: 10%; VOLTAGE: 6.3V; TYPE: X5R; PRT_NUM: 7000275; PKG_TYPE: 0805; ROHS: ROHS
C204 C205 = CAP_NON_POLARIZED.2: PART_SPEC: CAPACITOR; LEVEL: STD; TYPE: X7R; TOLERANCE: 10%; VOLTAGE: 16V; PRT_NUM: 7000143; PKG_TYPE: 0805; ROHS: ROHS
C209 = CAP_NON_POLARIZED.2: PART_SPEC: CAPACITOR; LEVEL: STD; TYPE: X5R; TOLERANCE: 10%; VOLTAGE: 6.3V; PRT_NUM: 7000275; PKG_TYPE: 0805; ROHS: ROHS
C271 = CAP_NON_POLARIZED.2: PART_SPEC: CAPACITOR; LEVEL: STD; PRT_NUM: 7000461; TYPE: X5R CER; VOLTAGE: 10V; TOLERANCE: 10%; PKG_TYPE: 0805; ROHS: ROHS
CT3 = CAP_POLARIZED.3: PART_SPEC: CAPACITOR; LEVEL: STD; TOLERANCE: 10%; VOLTAGE: 10V; PRT_NUM: 7000303; BOARDS: BOTH; PKG_TYPE: C; TYPE: TANT-LOW-ESR; ROHS: ROHS
CT4 = CAP_POLARIZED.3: PART_SPEC: CAPACITOR; LEVEL: STD; TOLERANCE: 20%; VOLTAGE: 6.3V; PRT_NUM: 7000357; PKG_TYPE: D2E; ROHS: ROHS; TYPE: TANT
CT5 = CAP_POLARIZED.3: PART_SPEC: CAPACITOR; LEVEL: STD; BOARDS: BOTH; PRT_NUM: 7000303; VOLTAGE: 10V; TOLERANCE: 10%; PKG_TYPE: C; ROHS: ROHS; TYPE: TANT-LOW-ESR
CT6 = CAP_POLARIZED.3: PART_SPEC: CAPACITOR; LEVEL: STD; TOLERANCE: 10%; VOLTAGE: 35V; PRT_NUM: 7000078; PKG_TYPE: B; ROHS: ROHS; TYPE: TANT
D4 = DIO_SCHOTTKY.3: SCHOT_RECT; LEVEL: STD; PRT_NUM: 7000553; CURRENT: 5A; PKG_TYPE: SMC; ROHS: ROHS; WEB: http://www.onsemi.com/PowerSolutions/product.do?id
D5 = DIO_SCHOTTKY_3.3: SCHOTTKY; LEVEL: STD; CURRENT: 1A; BOARDS: BOTH; VALUE: 1A; PRT_NUM: 7000252; PKG_TYPE: SOT23-312; WEB: http://www.zetex.com/3.0/3-3-3.asp?pn; ROHS: ROHS
D13 = DIO_SCHOTTKY.3: SCHOT_RECT; LEVEL: STD; CURRENT: 5A; PRT_NUM: 7000553; PKG_TYPE: SMC; WEB: http://www.onsemi.com/PowerSolutions/product.do?id; ROHS: ROHS
D15 = DIO_SCHOTTKY.1: SCHOT_RECT; LEVEL: STD; PRT_NUM: 7000553; CURRENT: 5A; PKG_TYPE: SMC; ROHS: ROHS; WEB: http://www.onsemi.com/PowerSolutions/product.do?id
F1 = FUS_STANDARD.1: RESETABLE; PART_SPEC: FUSE; LEVEL: STD; PRT_NUM: 6000821; PKG_TYPE: FUS005; TYPE: RESETABLE; ROHS: ROHS
FER15 FER17 = FER_STANDARD.1: PART_SPEC: FERRITE; LEVEL: STD; FREQ: 100MHZ; PRT_NUM: 7000117; CURRENT: 500MA; PKG_TYPE: 1206; ROHS: ROHS
FER16 = FER_STANDARD.1: PART_SPEC: FERRITE; LEVEL: STD; FREQ: 100MHZ; CURRENT: 500MA; PRT_NUM: 7000117; PKG_TYPE: 1206; ROHS: ROHS
FER19 = FER_CHOKE.1: PART_SPEC: FERRITE; LEVEL: STD; FREQ: 100MHZ; PRT_NUM: 7000232; CURRENT: 5A; PKG_TYPE: FER002; ROHS: ROHS
J7 = CON_POWER.1: RA; PART_SPEC: CONNECTOR; LEVEL: STD; CONFIGURATION: 2.5MM_JACK; PRT_NUM: 6000018; PKG_TYPE: CON005; TYPE: PWR; ROHS: ROHS
JP4 JP5 = CON_2X1.2: HEADER; PART_SPEC: CONNECTOR; LEVEL: STD; PRT_NUM: 6000774; CONFIGURATION: 2X1; PKG_TYPE: IDC2X1; TYPE: IDC; ROHS: ROHS
JP10 = CON_2X1.2: HEADER; PART_SPEC: CONNECTOR; LEVEL: STD; CONFIGURATION: 2X1; PRT_NUM: 6000774; PKG_TYPE: IDC2X1; ROHS: ROHS; TYPE: IDC
L1 = IND_STANDARD.1: PART_SPEC: INDUCTOR; LEVEL: STD; TOLERANCE: 20%; RESISTANCE: 47; PRT_NUM: 7000212; BOARDS: BOTH; PKG_TYPE: IND001; ROHS: ROHS
L2 = IND_STANDARD.1: PART_SPEC: INDUCTOR; LEVEL: STD; TOLERANCE: 30%; PRT_NUM: 7000563; PKG_TYPE: IND013; ROHS: ROHS
R155 = RES_STANDARD.1: PART_SPEC: RESISTOR; LEVEL: STD; TOLERANCE: 1%; POWER: 1/10W; PRT_NUM: 7000453; PKG_TYPE: 0603; ROHS: ROHS
R156 = RES_STANDARD.1: PART_SPEC: RESISTOR; LEVEL: STD; TOLERANCE: 5%; POWER: 1/10W; PRT_NUM: 7000371; PKG_TYPE: 0603; ROHS: ROHS
R157 = RES_STANDARD.2: PART_SPEC: RESISTOR; LEVEL: STD; TOLERANCE: 1%; POWER: 1/2W; PRT_NUM: 7000486; PKG_TYPE: 1206; ROHS: ROHS
R159 = RES_STANDARD.1: PART_SPEC: RESISTOR; LEVEL: STD; TOLERANCE: 1%; POWER: 1/10W; PRT_NUM: 7000522; PKG_TYPE: 0603; ROHS: ROHS
R160 = RES_STANDARD.2: PART_SPEC: RESISTOR; LEVEL: STD; TOLERANCE: 1%; POWER: 1/10W; PRT_NUM: 7000521; PKG_TYPE: 0603; ROHS: ROHS
R164 = RES_STANDARD.2: PART_SPEC: RESISTOR; LEVEL: STD; POWER: 1/4W; PRT_NUM: 7000311; TOLERANCE: 1%; PKG_TYPE: 0805; ROHS: ROHS
R165 = RES_STANDARD.2: PART_SPEC: RESISTOR; LEVEL: STD; POWER: 1/10W; PRT_NUM: 7000309; TOLERANCE: 1%; PKG_TYPE: 0805; ROHS: ROHS
R192 = RES_STANDARD.1: PART_SPEC: RESISTOR; LEVEL: STD; TOLERANCE: 1%; POWER: 1/2W; PRT_NUM: 7000486; PKG_TYPE: 1206; ROHS: ROHS
R194 R267 = RES_STANDARD.1: PART_SPEC: RESISTOR; LEVEL: STD; PRT_NUM: 7000486; POWER: 1/2W; TOLERANCE: 1%; PKG_TYPE: 1206; ROHS: ROHS
R204 = RES_STANDARD.2: PART_SPEC: RESISTOR; LEVEL: STD; PRT_NUM: 7000486; POWER: 1/2W; TOLERANCE: 1%; PKG_TYPE: 1206; ROHS: ROHS
R207 = RES_STANDARD.2: PART_SPEC: RESISTOR; LEVEL: STD; POWER: 1/16W; TOLERANCE: 5%; PRT_NUM: 7000282; BOARDS: BOTH; PKG_TYPE: 0402; ROHS: ROHS
R265 = RES_STANDARD.2: PART_SPEC: RESISTOR; LEVEL: STD; TOLERANCE: 1%; PRT_NUM: 7000582; POWER: 1/16W; PKG_TYPE: 0402; ROHS: ROHS
R266 = RES_STANDARD.2: PART_SPEC: RESISTOR; LEVEL: STD; TOLERANCE: 1%; PRT_NUM: 7000464; POWER: 1/16W; PKG_TYPE: 0603; ROHS: ROHS
TP11 TP12 TP15 TP26 = MSC_TEST_POINT.1: TESTPOINT; CLASS: DNP; LEVEL: STD; BOARDS: BOTH; PART_SPEC: TESTPOINT; PART: TESTPOINT; ROHS: ROHS; PKG_TYPE: TP
TP17 = MSC_TEST_POINT.1: TESTPOINT; CLASS: DNP; LEVEL: STD; PART_SPEC: TESTPOINT; PART: TESTPOINT; ROHS: ROHS; PKG_TYPE: TP
U16 = ICS_NDS8434A.1: P_CHANNEL MOSFET; LEVEL: STD; PRT_NUM: 1000419; PKG_TYPE: SO-8; WEB: http://www.vishay.com/product?docid; ROHS: ROHS
U28 = ICS_NDS8434A.1: 2.5V P-MOSFET; LEVEL: STD; BOARDS: BOTH; PRT_NUM: 1000318; PKG_TYPE: SOIC8; WEB: http://www.fairchildsemi.com/pf/FD/FDS9431A.html; ROHS: ROHS
VR3 = ICS_ADP1864.1: 3-14V IN STEPDOWN CONVERT; LEVEL: STD; PRT_NUM: 30-025758-01; PKG_TYPE: SOT23-6; WEB: http://www.analog.com/en/prod/0%2C2877%2CADP1864%2C00.html; ROHS: ROHS
VR4 = ICS_ADP1715.1: ADJ 500MA REG 0.8V TO 5V; LEVEL: STD; PRT_NUM: 30-025764-01; PKG_TYPE: MSOP8; WEB: http://www.analog.com/en/prod/0%2C2877%2CADP1715%2C00.html; ROHS: ROHS
VR5 = ICS_ADP3336.1: ADJ 500MA REGULATOR; LEVEL: STD; PRT_NUM: 30-025190-01; PKG_TYPE: MSOP8; ROHS: ROHS; WEB: HTTP://WWW.ANALOG.COM/EN/PROD/0%2C2877%2CADP3336%2C00.HTML
W2 = MSC_COPPER.1: LEVEL: STD; CLASS: DNP; PKG_TYPE: 4A